# Altium project Skipper.PrjPcb (part 1 of 2)
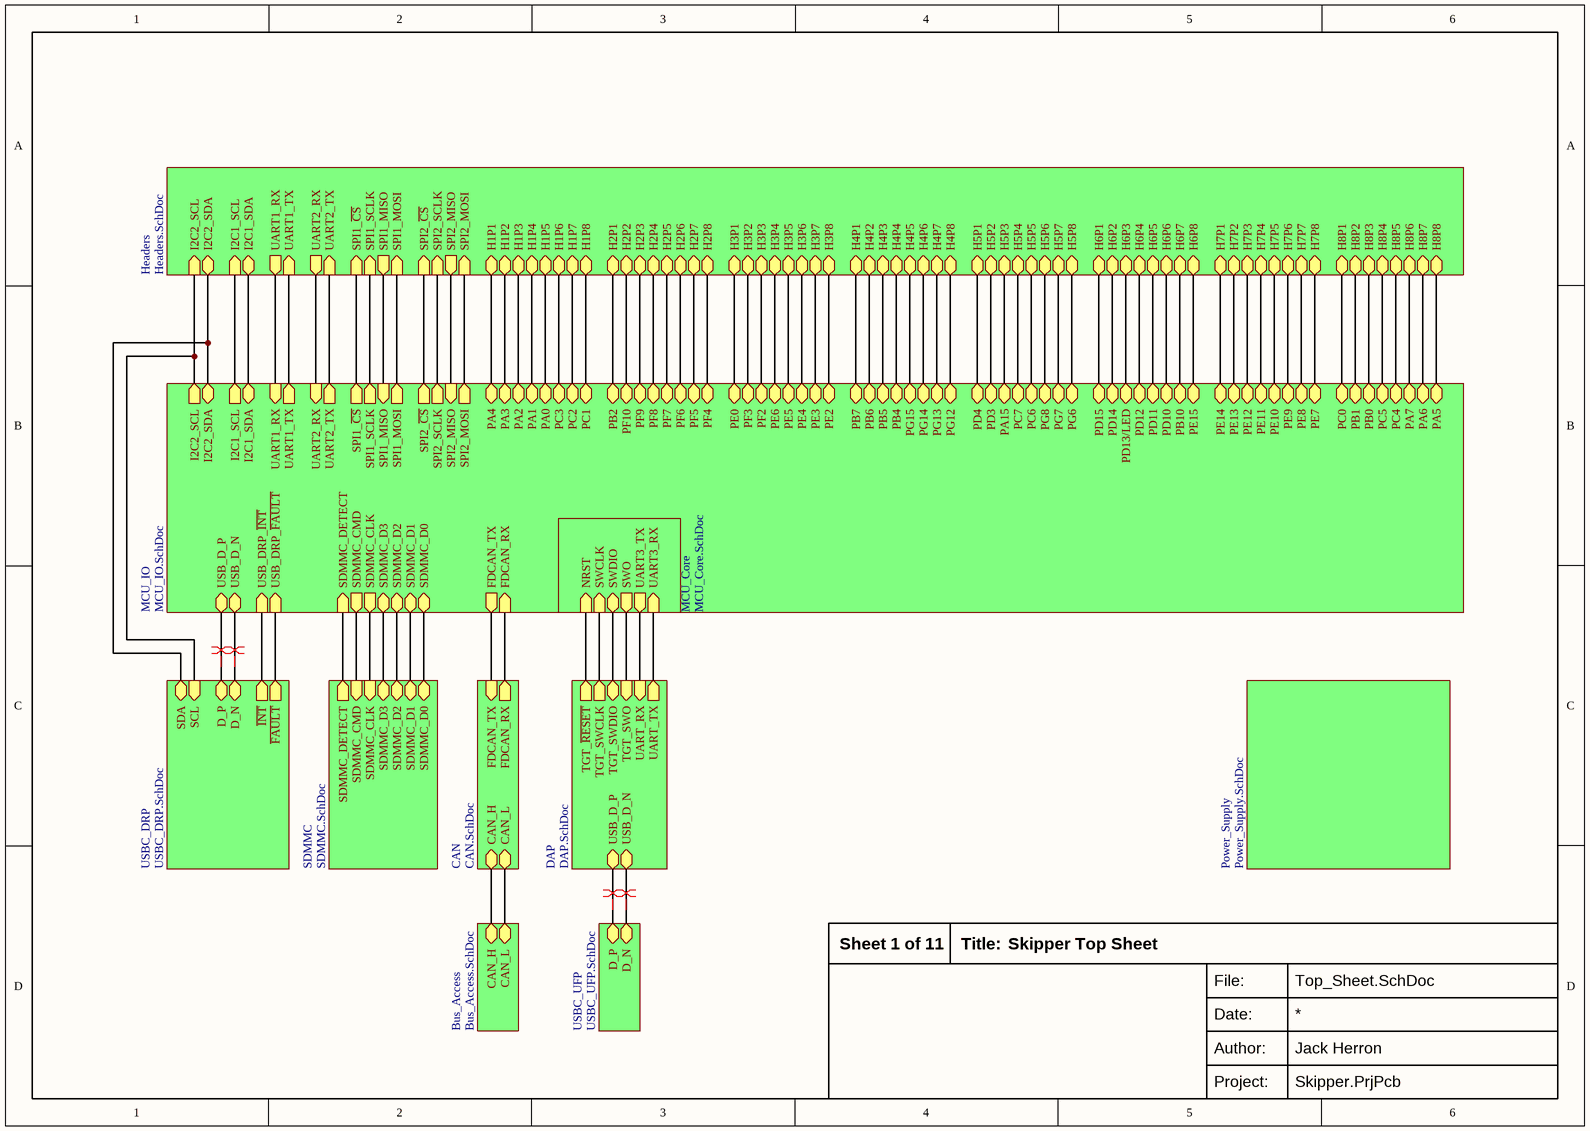
[diagram p0: Top_Sheet.SchDoc]
11 sheets, 219 parts. Net scope: hierarchical (ports join the sheet entries above them; power ports are global).
Board files: Skipper.PcbDoc, Panel.PcbDoc
Sheets:
  Top_Sheet.SchDoc
    MCU_IO = MCU_IO.SchDoc
    MCU_Core = MCU_Core.SchDoc
    SDMMC = SDMMC.SchDoc
    USBC_DRP = USBC_DRP.SchDoc
    USBC_UFP = USBC_UFP.SchDoc
    CAN = CAN.SchDoc
    DAP = DAP.SchDoc
    Power_Supply = Power_Supply.SchDoc
    Bus_Access = Bus_Access.SchDoc
    Headers = Headers.SchDoc

## Sheet Top_Sheet.SchDoc: Skipper Top Sheet
size 297 x 210 mm; Author: Jack Herron; SheetNumber: 1; SheetTotal: 11

### Sub-sheets
Bus_Access = Bus_Access.SchDoc: CAN_H (bidir), CAN_L (bidir)
CAN = CAN.SchDoc: CAN_H (bidir), FDCAN_TX (in), FDCAN_RX (out), CAN_L (bidir)
DAP = DAP.SchDoc: TGT_~{RESET} (out), TGT_SWCLK (out), USB_D_N (bidir), USB_D_P (bidir), TGT_SWDIO (bidir), TGT_SWO (in), UART_RX (in), UART_TX (out)
Headers = Headers.SchDoc: H1P1 (bidir), H1P2 (bidir), H1P3 (bidir), H1P4 (bidir), H1P5 (bidir), H1P6 (bidir), H1P7 (bidir), H1P8 (bidir), H2P1 (bidir), H2P2 (bidir), H2P3 (bidir), H2P4 (bidir), H2P5 (bidir), H2P6 (bidir), H2P7 (bidir), H2P8 (bidir), H3P1 (bidir), H3P2 (bidir), H3P3 (bidir), H3P4 (bidir), H3P5 (bidir), H3P6 (bidir), H3P7 (bidir), H3P8 (bidir), SPI1_MOSI (in), SPI1_SCLK (in), SPI1_~{CS} (in), SPI1_MISO (out), SPI2_MISO (out), SPI2_~{CS} (in), SPI2_SCLK (in), SPI2_MOSI (in), UART2_TX (in), UART1_TX (in), UART2_RX (out), UART1_RX (out), H4P1 (bidir), H4P2 (bidir), H4P3 (bidir), H4P4 (bidir), H4P5 (bidir), H4P6 (bidir), H4P7 (bidir), H4P8 (bidir), H5P1 (bidir), H5P2 (bidir), H5P3 (bidir), H5P4 (bidir), H5P5 (bidir), H5P6 (bidir), H5P8 (bidir), H5P7 (bidir), H6P1 (bidir), H6P2 (bidir), H6P3 (bidir), H6P4 (bidir), H6P5 (bidir), H6P6 (bidir), H6P7 (bidir), H6P8 (bidir), H7P1 (bidir), H7P2 (bidir), H7P3 (bidir), H7P4 (bidir), H7P5 (bidir), H7P6 (bidir), H7P7 (bidir), H7P8 (bidir), H8P2 (bidir), H8P1 (bidir), H8P3 (bidir), H8P4 (bidir), H8P5 (bidir), H8P6 (bidir), H8P7 (bidir), H8P8 (bidir), I2C2_SDA (bidir), I2C2_SCL (in), I2C1_SDA (bidir), I2C1_SCL (in)
MCU_Core = MCU_Core.SchDoc: SWDIO (bidir), NRST (in), SWCLK (in), SWO (out), UART3_TX (out), UART3_RX (in)
MCU_IO = MCU_IO.SchDoc: PA4 (bidir), PA3 (bidir), PA2 (bidir), PA1 (bidir), PA0 (bidir), PC3 (bidir), PC2 (bidir), PC1 (bidir), PD4 (bidir), PD3 (bidir), PA15 (bidir), PC7 (bidir), PC6 (bidir), PG8 (bidir), PG7 (bidir), PG6 (bidir), PB2 (bidir), PF10 (bidir), PF9 (bidir), PF8 (bidir), PF7 (bidir), PF6 (bidir), PF5 (bidir), PF4 (bidir), PE0 (bidir), PF3 (bidir), PF2 (bidir), PE6 (bidir), PE5 (bidir), PE4 (bidir), PE3 (bidir), PE2 (bidir), PB7 (bidir), PB6 (bidir), PB5 (bidir), PB4 (bidir), PG15 (bidir), PG14 (bidir), PG13 (bidir), PG12 (bidir), PD15 (bidir), PD14 (bidir), PD13/LED (bidir), PD12 (bidir), PD11 (bidir), PD10 (bidir), PB10 (bidir), PE15 (bidir), PE14 (bidir), PE13 (bidir), PE12 (bidir), PE11 (bidir), PE10 (bidir), PE9 (bidir), PE8 (bidir), PE7 (bidir), PC0 (bidir), PB1 (bidir), PB0 (bidir), PC5 (bidir), PC4 (bidir), PA7 (bidir), PA6 (bidir), PA5 (bidir), SPI2_MOSI (out), SPI2_MISO (in), SPI2_SCLK (out), SPI2_~{CS} (out), SPI1_MOSI (out), SPI1_MISO (in), SPI1_SCLK (out), SPI1_~{CS} (out), UART2_TX (out), UART2_RX (in), UART1_TX (out), UART1_RX (in), USB_D_P (bidir), USB_D_N (bidir), SDMMC_D0 (bidir), SDMMC_D1 (bidir), SDMMC_D2 (bidir), SDMMC_D3 (bidir), SDMMC_CLK (out), SDMMC_CMD (out), SDMMC_DETECT (in), FDCAN_RX (in), FDCAN_TX (out), USB_DRP_~{INT} (in), USB_DRP_~{FAULT} (in), I2C2_SDA (bidir), I2C2_SCL (out), I2C1_SDA (bidir), I2C1_SCL (out)
Power_Supply = Power_Supply.SchDoc: no entries
SDMMC = SDMMC.SchDoc: SDMMC_D0 (bidir), SDMMC_D1 (bidir), SDMMC_D2 (bidir), SDMMC_D3 (bidir), SDMMC_CLK (in), SDMMC_CMD (in), SDMMC_DETECT (out)
USBC_DRP = USBC_DRP.SchDoc: D_P (bidir), D_N (bidir), ~{INT} (out), ~{FAULT} (out), SCL (in), SDA (bidir)
USBC_UFP = USBC_UFP.SchDoc: D_P (bidir), D_N (bidir)

### Nets
CAN_H: sheet CAN/CAN_H, sheet Bus_Access/CAN_H
CAN_L: sheet CAN/CAN_L, sheet Bus_Access/CAN_L
DAP_D_N: sheet USBC_UFP/D_N, sheet DAP/USB_D_N
DAP_D_P: sheet USBC_UFP/D_P, sheet DAP/USB_D_P
DAP_RX: sheet MCU_Core/UART3_TX, sheet DAP/UART_RX
DAP_TX: sheet MCU_Core/UART3_RX, sheet DAP/UART_TX
FDCAN_RX: sheet MCU_IO/FDCAN_RX, sheet CAN/FDCAN_RX
FDCAN_TX: sheet MCU_IO/FDCAN_TX, sheet CAN/FDCAN_TX
I2C1_SCL: sheet MCU_IO/I2C1_SCL, sheet Headers/I2C1_SCL
I2C1_SDA: sheet MCU_IO/I2C1_SDA, sheet Headers/I2C1_SDA
I2C2_SCL: sheet MCU_IO/I2C2_SCL, sheet USBC_DRP/SCL, sheet Headers/I2C2_SCL
I2C2_SDA: sheet MCU_IO/I2C2_SDA, sheet USBC_DRP/SDA, sheet Headers/I2C2_SDA
NRST: sheet MCU_Core/NRST, sheet DAP/TGT_~{RESET}
PA0: sheet MCU_IO/PA0, sheet Headers/H1P5
PA1: sheet MCU_IO/PA1, sheet Headers/H1P4
PA2: sheet MCU_IO/PA2, sheet Headers/H1P3
PA3: sheet MCU_IO/PA3, sheet Headers/H1P2
PA4: sheet MCU_IO/PA4, sheet Headers/H1P1
PA5: sheet MCU_IO/PA5, sheet Headers/H8P8
PA6: sheet MCU_IO/PA6, sheet Headers/H8P7
PA7: sheet MCU_IO/PA7, sheet Headers/H8P6
PA15: sheet MCU_IO/PA15, sheet Headers/H5P3
PB0: sheet MCU_IO/PB0, sheet Headers/H8P3
PB1: sheet MCU_IO/PB1, sheet Headers/H8P2
PB2: sheet MCU_IO/PB2, sheet Headers/H2P1
PB4: sheet MCU_IO/PB4, sheet Headers/H4P4
PB5: sheet MCU_IO/PB5, sheet Headers/H4P3
PB6: sheet MCU_IO/PB6, sheet Headers/H4P2
PB7: sheet MCU_IO/PB7, sheet Headers/H4P1
PB10: sheet MCU_IO/PB10, sheet Headers/H6P7
PC0: sheet MCU_IO/PC0, sheet Headers/H8P1
PC1: sheet MCU_IO/PC1, sheet Headers/H1P8
PC2: sheet MCU_IO/PC2, sheet Headers/H1P7
PC3: sheet MCU_IO/PC3, sheet Headers/H1P6
PC4: sheet MCU_IO/PC4, sheet Headers/H8P5
PC5: sheet MCU_IO/PC5, sheet Headers/H8P4
PC6: sheet MCU_IO/PC6, sheet Headers/H5P5
PC7: sheet MCU_IO/PC7, sheet Headers/H5P4
PD3: sheet MCU_IO/PD3, sheet Headers/H5P2
PD4: sheet MCU_IO/PD4, sheet Headers/H5P1
PD10: sheet MCU_IO/PD10, sheet Headers/H6P6
PD11: sheet MCU_IO/PD11, sheet Headers/H6P5
PD12: sheet MCU_IO/PD12, sheet Headers/H6P4
PD13/LED: sheet MCU_IO/PD13/LED, sheet Headers/H6P3
PD14: sheet MCU_IO/PD14, sheet Headers/H6P2
PD15: sheet MCU_IO/PD15, sheet Headers/H6P1
PE0: sheet MCU_IO/PE0, sheet Headers/H3P1
PE2: sheet MCU_IO/PE2, sheet Headers/H3P8
PE3: sheet MCU_IO/PE3, sheet Headers/H3P7
PE4: sheet MCU_IO/PE4, sheet Headers/H3P6
PE5: sheet MCU_IO/PE5, sheet Headers/H3P5
PE6: sheet MCU_IO/PE6, sheet Headers/H3P4
PE7: sheet MCU_IO/PE7, sheet Headers/H7P8
PE8: sheet MCU_IO/PE8, sheet Headers/H7P7
PE9: sheet MCU_IO/PE9, sheet Headers/H7P6
PE10: sheet MCU_IO/PE10, sheet Headers/H7P5
PE11: sheet MCU_IO/PE11, sheet Headers/H7P4
PE12: sheet MCU_IO/PE12, sheet Headers/H7P3
PE13: sheet MCU_IO/PE13, sheet Headers/H7P2
PE14: sheet MCU_IO/PE14, sheet Headers/H7P1
PE15: sheet MCU_IO/PE15, sheet Headers/H6P8
PF2: sheet MCU_IO/PF2, sheet Headers/H3P3
PF3: sheet MCU_IO/PF3, sheet Headers/H3P2
PF4: sheet MCU_IO/PF4, sheet Headers/H2P8
PF5: sheet MCU_IO/PF5, sheet Headers/H2P7
PF6: sheet MCU_IO/PF6, sheet Headers/H2P6
PF7: sheet MCU_IO/PF7, sheet Headers/H2P5
PF8: sheet MCU_IO/PF8, sheet Headers/H2P4
PF9: sheet MCU_IO/PF9, sheet Headers/H2P3
PF10: sheet MCU_IO/PF10, sheet Headers/H2P2
PG6: sheet MCU_IO/PG6, sheet Headers/H5P8
PG7: sheet MCU_IO/PG7, sheet Headers/H5P7
PG8: sheet MCU_IO/PG8, sheet Headers/H5P6
PG12: sheet MCU_IO/PG12, sheet Headers/H4P8
PG13: sheet MCU_IO/PG13, sheet Headers/H4P7
PG14: sheet MCU_IO/PG14, sheet Headers/H4P6
PG15: sheet MCU_IO/PG15, sheet Headers/H4P5
SDMMC_CLK: sheet MCU_IO/SDMMC_CLK, sheet SDMMC/SDMMC_CLK
SDMMC_CMD: sheet MCU_IO/SDMMC_CMD, sheet SDMMC/SDMMC_CMD
SDMMC_D0: sheet MCU_IO/SDMMC_D0, sheet SDMMC/SDMMC_D0
SDMMC_D1: sheet MCU_IO/SDMMC_D1, sheet SDMMC/SDMMC_D1
SDMMC_D2: sheet MCU_IO/SDMMC_D2, sheet SDMMC/SDMMC_D2
SDMMC_D3: sheet MCU_IO/SDMMC_D3, sheet SDMMC/SDMMC_D3
SDMMC_DETECT: sheet MCU_IO/SDMMC_DETECT, sheet SDMMC/SDMMC_DETECT
SPI1_~{CS}: sheet MCU_IO/SPI1_~{CS}, sheet Headers/SPI1_~{CS}
SPI1_MISO: sheet MCU_IO/SPI1_MISO, sheet Headers/SPI1_MISO
SPI1_MOSI: sheet MCU_IO/SPI1_MOSI, sheet Headers/SPI1_MOSI
SPI1_SCLK: sheet MCU_IO/SPI1_SCLK, sheet Headers/SPI1_SCLK
SPI2_~{CS}: sheet MCU_IO/SPI2_~{CS}, sheet Headers/SPI2_~{CS}
SPI2_MISO: sheet MCU_IO/SPI2_MISO, sheet Headers/SPI2_MISO
SPI2_MOSI: sheet MCU_IO/SPI2_MOSI, sheet Headers/SPI2_MOSI
SPI2_SCLK: sheet MCU_IO/SPI2_SCLK, sheet Headers/SPI2_SCLK
SWCLK: sheet MCU_Core/SWCLK, sheet DAP/TGT_SWCLK
SWDIO: sheet MCU_Core/SWDIO, sheet DAP/TGT_SWDIO
SWO: sheet MCU_Core/SWO, sheet DAP/TGT_SWO
UART1_RX: sheet MCU_IO/UART1_RX, sheet Headers/UART1_RX
UART1_TX: sheet MCU_IO/UART1_TX, sheet Headers/UART1_TX
UART2_RX: sheet MCU_IO/UART2_RX, sheet Headers/UART2_RX
UART2_TX: sheet MCU_IO/UART2_TX, sheet Headers/UART2_TX
USB_D_N: sheet MCU_IO/USB_D_N, sheet USBC_DRP/D_N
USB_D_P: sheet MCU_IO/USB_D_P, sheet USBC_DRP/D_P
USB_DRP_~{FAULT}: sheet MCU_IO/USB_DRP_~{FAULT}, sheet USBC_DRP/~{FAULT}
USB_DRP_~{INT}: sheet MCU_IO/USB_DRP_~{INT}, sheet USBC_DRP/~{INT}

### Layout directives
differential pair: DAP_D_N, DAP_D_P, USB_D_N, USB_D_P

### Notes on the sheet
- Title:
- File:
- Date:
- Project:
- Author:

## Sheet MCU_IO.SchDoc: Skipper MCU IO
size 297 x 210 mm; Author: Jack Herron; SheetNumber: 2; SheetTotal: 11
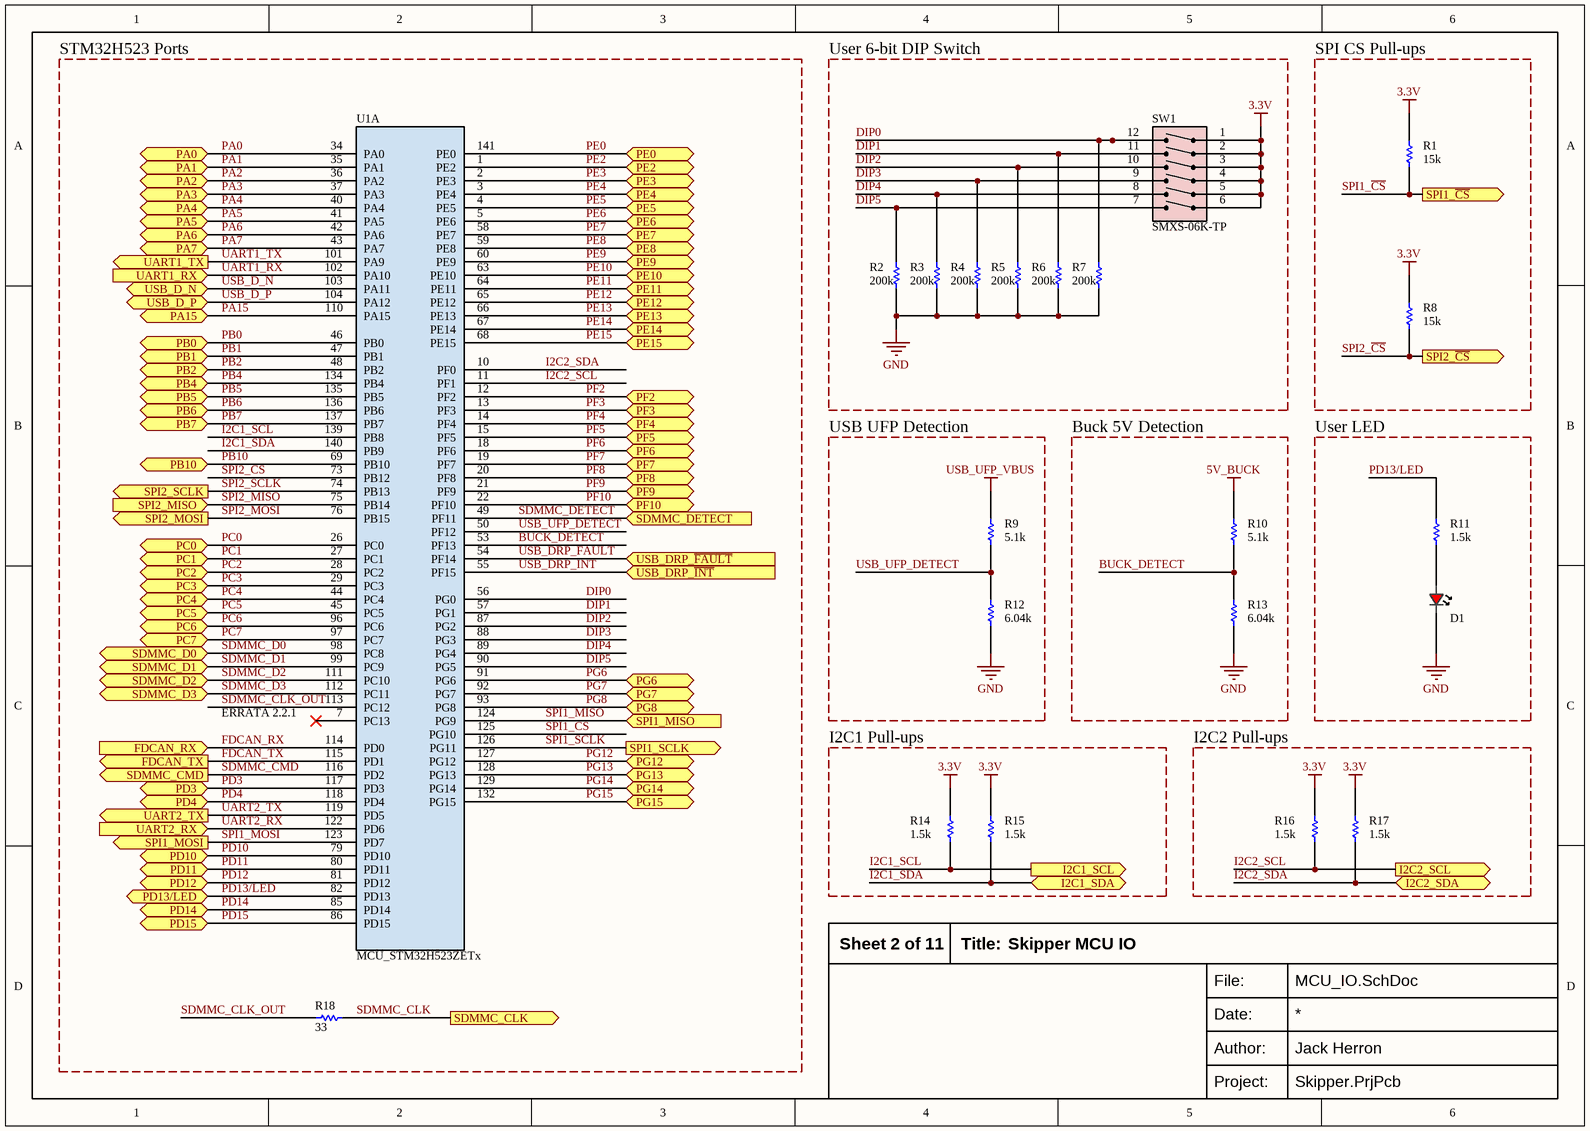
[diagram p1: MCU_IO.SchDoc]

### Parts
D1  KT-0603R  [LED-0603]  (value not drawn)
R1  value 15k  [RESISTOR-0402]  (hidden comment: 0402WGF1502TCE)
R2  value 200k  [RESISTOR-0402]  (hidden comment: 0402WGF2003TCE)
R3  value 200k  [RESISTOR-0402]  (hidden comment: 0402WGF2003TCE)
R4  value 200k  [RESISTOR-0402]  (hidden comment: 0402WGF2003TCE)
R5  value 200k  [RESISTOR-0402]  (hidden comment: 0402WGF2003TCE)
R6  value 200k  [RESISTOR-0402]  (hidden comment: 0402WGF2003TCE)
R7  value 200k  [RESISTOR-0402]  (hidden comment: 0402WGF2003TCE)
R8  value 15k  [RESISTOR-0402]  (hidden comment: 0402WGF1502TCE)
R9  value 5.1k  [RESISTOR-0402]  (hidden comment: 0402WGF5101TCE)
R10  value 5.1k  [RESISTOR-0402]  (hidden comment: 0402WGF5101TCE)
R11  value 1.5k  [RESISTOR-0402]  (hidden comment: 0402WGF1501TCE)
R12  value 6.04k  [RESISTOR-0402]  (hidden comment: RC0402FR-076K04L)
R13  value 6.04k  [RESISTOR-0402]  (hidden comment: RC0402FR-076K04L)
R14  value 1.5k  [RESISTOR-0402]  (hidden comment: 0402WGF1501TCE)
R15  value 1.5k  [RESISTOR-0402]  (hidden comment: 0402WGF1501TCE)
R16  value 1.5k  [RESISTOR-0402]  (hidden comment: 0402WGF1501TCE)
R17  value 1.5k  [RESISTOR-0402]  (hidden comment: 0402WGF1501TCE)
R18  value 33  [RESISTOR-0402]  (hidden comment: 0402WGF330JTCE)
SW1  SMXS-06K-TP  [SWITCH_SMXS-06K-TP]
U1  MCU_STM32H523ZETx  [LQFP-144-22x22]  (part A of 3)

### Blocks framed on the sheet
STM32H523 Ports: R18 U1
User 6-bit DIP Switch: R2-R7 SW1
SPI CS Pull-ups: R1 R8
USB UFP Detection: R9 R12
Buck 5V Detection: R10 R13
User LED: D1 R11
I2C1 Pull-ups: R14 R15
I2C2 Pull-ups: R16 R17

### Ports
FDCAN_RX (in, see Top_Sheet[2C], CAN[2B]), FDCAN_TX (out, see Top_Sheet[2C], CAN[2B]), I2C1_SCL (out, see Top_Sheet[1B], Headers[1D]), I2C1_SDA (bidir, see Top_Sheet[1B], Headers[1D]), I2C2_SCL (out, see Top_Sheet[1B], Headers[3D]), I2C2_SDA (bidir, see Top_Sheet[1B], Headers[3D]), PA0 (bidir, see Top_Sheet[3B]), PA1 (bidir, see Top_Sheet[3B]), PA2 (bidir, see Top_Sheet[2B]), PA3 (bidir, see Top_Sheet[2B]), PA4 (bidir, see Top_Sheet[2B]), PA5 (bidir, see Top_Sheet[6B]), PA6 (bidir, see Top_Sheet[6B]), PA7 (bidir, see Top_Sheet[6B]), PA15 (bidir, see Top_Sheet[4B]), PB0 (bidir, see Top_Sheet[6B]), PB1 (bidir, see Top_Sheet[6B]), PB2 (bidir, see Top_Sheet[3B]), PB4 (bidir, see Top_Sheet[4B]), PB5 (bidir, see Top_Sheet[4B]), PB6 (bidir, see Top_Sheet[4B]), PB7 (bidir, see Top_Sheet[4B]), PB10 (bidir, see Top_Sheet[5B]), PC0 (bidir, see Top_Sheet[6B]), PC1 (bidir, see Top_Sheet[3B]), PC2 (bidir, see Top_Sheet[3B]), PC3 (bidir, see Top_Sheet[3B]), PC4 (bidir, see Top_Sheet[6B]), PC5 (bidir, see Top_Sheet[6B]), PC6 (bidir, see Top_Sheet[4B]), PC7 (bidir, see Top_Sheet[4B]), PD3 (bidir, see Top_Sheet[4B]), PD4 (bidir, see Top_Sheet[4B]), PD10 (bidir, see Top_Sheet[5B]), PD11 (bidir, see Top_Sheet[5B]), PD12 (bidir, see Top_Sheet[5B]), PD13/LED (bidir, see Top_Sheet[5B]), PD14 (bidir, see Top_Sheet[5B]), PD15 (bidir, see Top_Sheet[5B]), PE0 (bidir, see Top_Sheet[3B]), PE2 (bidir, see Top_Sheet[4B]), PE3 (bidir, see Top_Sheet[4B]), PE4 (bidir, see Top_Sheet[4B]), PE5 (bidir, see Top_Sheet[3B]), PE6 (bidir, see Top_Sheet[3B]), PE7 (bidir, see Top_Sheet[5B]), PE8 (bidir, see Top_Sheet[5B]), PE9 (bidir, see Top_Sheet[5B]), PE10 (bidir, see Top_Sheet[5B]), PE11 (bidir, see Top_Sheet[5B]), PE12 (bidir, see Top_Sheet[5B]), PE13 (bidir, see Top_Sheet[5B]), PE14 (bidir, see Top_Sheet[5B]), PE15 (bidir, see Top_Sheet[5B]), PF2 (bidir, see Top_Sheet[3B]), PF3 (bidir, see Top_Sheet[3B]), PF4 (bidir, see Top_Sheet[3B]), PF5 (bidir, see Top_Sheet[3B]), PF6 (bidir, see Top_Sheet[3B]), PF7 (bidir, see Top_Sheet[3B]), PF8 (bidir, see Top_Sheet[3B]), PF9 (bidir, see Top_Sheet[3B]), PF10 (bidir, see Top_Sheet[3B]), PG6 (bidir, see Top_Sheet[5B]), PG7 (bidir, see Top_Sheet[5B]), PG8 (bidir, see Top_Sheet[4B]), PG12 (bidir, see Top_Sheet[4B]), PG13 (bidir, see Top_Sheet[4B]), PG14 (bidir, see Top_Sheet[4B]), PG15 (bidir, see Top_Sheet[4B]), SDMMC_CLK (out, see Top_Sheet[2C], SDMMC[2C]), SDMMC_CMD (out, see Top_Sheet[2C], SDMMC[2C]), SDMMC_D0 (bidir, see Top_Sheet[2C], SDMMC[2B]), SDMMC_D1 (bidir, see Top_Sheet[2C], SDMMC[2B]), SDMMC_D2 (bidir, see Top_Sheet[2C], SDMMC[2C]), SDMMC_D3 (bidir, see Top_Sheet[2C], SDMMC[2C]), SDMMC_DETECT (in, see Top_Sheet[2C], SDMMC[2C]), SPI1_MISO (in, see Top_Sheet[2B], Headers[1D]), SPI1_MOSI (out, see Top_Sheet[2B], Headers[1D]), SPI1_SCLK (out, see Top_Sheet[2B], Headers[1C]), SPI1_~{CS} (out, see Top_Sheet[2B], Headers[1C]), SPI2_MISO (in, see Top_Sheet[2B], Headers[3D]), SPI2_MOSI (out, see Top_Sheet[2B], Headers[3D]), SPI2_SCLK (out, see Top_Sheet[2B], Headers[3C]), SPI2_~{CS} (out, see Top_Sheet[2B], Headers[3C]), UART1_RX (in, see Top_Sheet[2B], Headers[1D]), UART1_TX (out, see Top_Sheet[2B], Headers[1D]), UART2_RX (in, see Top_Sheet[2B], Headers[3D]), UART2_TX (out, see Top_Sheet[2B], Headers[3D]), USB_D_N (bidir, see Top_Sheet[1C]), USB_D_P (bidir, see Top_Sheet[1C]), USB_DRP_~{FAULT} (in, see Top_Sheet[2C]), USB_DRP_~{INT} (in, see Top_Sheet[1C])

### Nets
3.3V: R1.2 R8.2 R14.2 R15.2 R16.2 R17.2 SW1.1 SW1.2 SW1.3 SW1.4 SW1.5 SW1.6
5V_BUCK: R10.2
GND: D1.K R2.1 R3.1 R4.1 R5.1 R6.1 R7.1 R12.1 R13.1
USB_UFP_VBUS: R9.2
BUCK_DETECT: R10.1 R13.2 U1.53(PF13)  [project net BUCK_DETECT_2]
DIP0: R7.2 SW1.12 U1.56(PG0)  [project net DIP0_2]
DIP1: R6.2 SW1.11 U1.57(PG1)  [project net DIP1_2]
DIP2: R5.2 SW1.10 U1.87(PG2)  [project net DIP2_2]
DIP3: R4.2 SW1.9 U1.88(PG3)  [project net DIP3_2]
DIP4: R3.2 SW1.8 U1.89(PG4)  [project net DIP4_2]
DIP5: R2.2 SW1.7 U1.90(PG5)  [project net DIP5_2]
FDCAN_RX: U1.114(PD0) ; port FDCAN_RX
FDCAN_TX: U1.115(PD1) ; port FDCAN_TX
I2C1_SCL: R14.1 U1.139(PB8) ; port I2C1_SCL
I2C1_SDA: R15.1 U1.140(PB9) ; port I2C1_SDA
I2C2_SCL: R16.1 U1.11(PF1) ; port I2C2_SCL
I2C2_SDA: R17.1 U1.10(PF0) ; port I2C2_SDA
PA0: U1.34(PA0) ; port PA0
PA1: U1.35(PA1) ; port PA1
PA2: U1.36(PA2) ; port PA2
PA3: U1.37(PA3) ; port PA3
PA4: U1.40(PA4) ; port PA4
PA5: U1.41(PA5) ; port PA5
PA6: U1.42(PA6) ; port PA6
PA7: U1.43(PA7) ; port PA7
PA15: U1.110(PA15) ; port PA15
PB0: U1.46(PB0) ; port PB0
PB1: U1.47(PB1) ; port PB1
PB2: U1.48(PB2) ; port PB2
PB4: U1.134(PB4) ; port PB4
PB5: U1.135(PB5) ; port PB5
PB6: U1.136(PB6) ; port PB6
PB7: U1.137(PB7) ; port PB7
PB10: U1.69(PB10) ; port PB10
PC0: U1.26(PC0) ; port PC0
PC1: U1.27(PC1) ; port PC1
PC2: U1.28(PC2) ; port PC2
PC3: U1.29(PC3) ; port PC3
PC4: U1.44(PC4) ; port PC4
PC5: U1.45(PC5) ; port PC5
PC6: U1.96(PC6) ; port PC6
PC7: U1.97(PC7) ; port PC7
PD3: U1.117(PD3) ; port PD3
PD4: U1.118(PD4) ; port PD4
PD10: U1.79(PD10) ; port PD10
PD11: U1.80(PD11) ; port PD11
PD12: U1.81(PD12) ; port PD12
PD13/LED: R11.2 U1.82(PD13) ; port PD13/LED
PD14: U1.85(PD14) ; port PD14
PD15: U1.86(PD15) ; port PD15
PE0: U1.141(PE0) ; port PE0
PE2: U1.1(PE2) ; port PE2
PE3: U1.2(PE3) ; port PE3
PE4: U1.3(PE4) ; port PE4
PE5: U1.4(PE5) ; port PE5
PE6: U1.5(PE6) ; port PE6
PE7: U1.58(PE7) ; port PE7
PE8: U1.59(PE8) ; port PE8
PE9: U1.60(PE9) ; port PE9
PE10: U1.63(PE10) ; port PE10
PE11: U1.64(PE11) ; port PE11
PE12: U1.65(PE12) ; port PE12
PE13: U1.66(PE13) ; port PE13
PE14: U1.67(PE14) ; port PE14
PE15: U1.68(PE15) ; port PE15
PF2: U1.12(PF2) ; port PF2
PF3: U1.13(PF3) ; port PF3
PF4: U1.14(PF4) ; port PF4
PF5: U1.15(PF5) ; port PF5
PF6: U1.18(PF6) ; port PF6
PF7: U1.19(PF7) ; port PF7
PF8: U1.20(PF8) ; port PF8
PF9: U1.21(PF9) ; port PF9
PF10: U1.22(PF10) ; port PF10
PG6: U1.91(PG6) ; port PG6
PG7: U1.92(PG7) ; port PG7
PG8: U1.93(PG8) ; port PG8
PG12: U1.127(PG12) ; port PG12
PG13: U1.128(PG13) ; port PG13
PG14: U1.129(PG14) ; port PG14
PG15: U1.132(PG15) ; port PG15
SDMMC_CLK: R18.1 ; port SDMMC_CLK
SDMMC_CLK_OUT: R18.2 U1.113(PC12)  [project net SDMMC_CLK_OUT_2]
SDMMC_CMD: U1.116(PD2) ; port SDMMC_CMD
SDMMC_D0: U1.98(PC8) ; port SDMMC_D0
SDMMC_D1: U1.99(PC9) ; port SDMMC_D1
SDMMC_D2: U1.111(PC10) ; port SDMMC_D2
SDMMC_D3: U1.112(PC11) ; port SDMMC_D3
SDMMC_DETECT: U1.49(PF11) ; port SDMMC_DETECT
SPI1_~{CS}: R1.1 U1.125(PG10) ; port SPI1_~{CS}
SPI1_MISO: U1.124(PG9) ; port SPI1_MISO
SPI1_MOSI: U1.123(PD7) ; port SPI1_MOSI
SPI1_SCLK: U1.126(PG11) ; port SPI1_SCLK
SPI2_~{CS}: R8.1 U1.73(PB12) ; port SPI2_~{CS}
SPI2_MISO: U1.75(PB14) ; port SPI2_MISO
SPI2_MOSI: U1.76(PB15) ; port SPI2_MOSI
SPI2_SCLK: U1.74(PB13) ; port SPI2_SCLK
UART1_RX: U1.102(PA10) ; port UART1_RX
UART1_TX: U1.101(PA9) ; port UART1_TX
UART2_RX: U1.122(PD6) ; port UART2_RX
UART2_TX: U1.119(PD5) ; port UART2_TX
USB_D_N: U1.103(PA11) ; port USB_D_N
USB_D_P: U1.104(PA12) ; port USB_D_P
USB_DRP_~{FAULT}: U1.54(PF14) ; port USB_DRP_~{FAULT}
USB_DRP_~{INT}: U1.55(PF15) ; port USB_DRP_~{INT}
USB_UFP_DETECT: R9.1 R12.2 U1.50(PF12)  [project net USB_UFP_DETECT_2]
NetD1_A: D1.A R11.1

Not connected (* = marked no-connect by the designer): U1 7(PC13)*

### Notes on the sheet
- ERRATA 2.2.1
- Title:
- File:
- Date:
- Project:
- Author:

### Library data of the parts
D1 = LED_KT-0603R: LED - Red - 0603; Manufacturer 1: Hubei KENTO Elec; Manufacturer Part Number 1: KT-0603R; Supplier 1: LCSC; Supplier Part Number 1: C2286
R1 R8 = RESISTOR_0402WGF1502TCE: Resistor - 15k - 0402; Manufacturer 1: UNI-ROYAL; Voltage: 50V; Wattage: 62.5mW; Manufacturer Part Number 1: 0402WGF1502TCE; Supplier 1: LCSC; Supplier Part Number 1: C25756
R2-R7 = RESISTOR_0402WGF2003TCE: Resistor - 200k - 0402; Manufacturer 1: UNI-ROYAL; Wattage: 62.5mW; Voltage: 50V; Manufacturer Part Number 1: 0402WGF2003TCE; Supplier 1: LCSC; Supplier Part Number 1: C25764
R9 R10 = RESISTOR_0402WGF5101TCE: Resistor - 5.1k - 0402; Manufacturer 1: UNI-ROYAL; Voltage: 50V; Wattage: 62.5mW; Manufacturer Part Number 1: 0402WGF5101TCE; Supplier 1: LCSC; Supplier Part Number 1: C25905
R11 R14-R17 = RESISTOR_0402WGF1501TCE: Resistor - 1.5k - 0402; Manufacturer 1: UNI-ROYAL; Voltage: 50V; Wattage: 62.5mW; Manufacturer Part Number 1: 0402WGF1501TCE; Supplier 1: LCSC; Supplier Part Number 1: C25867
R12 R13 = RESISTOR_RC0402FR-076K04L: Resistor - 6.04k - 0402; Manufacturer 1: Yageo; Voltage: 50V; Wattage: 62.5mW; Manufacturer Part Number 1: RC0402FR-076K04L; Supplier 1: LCSC; Supplier Part Number 1: C97819
R18 = RESISTOR_0402WGF330JTCE: Resistor - 33 -0402; Manufacturer 1: UNI-ROYAL(Uniroyal Elec); Voltage: 50V; Wattage: 62.5mW; Manufacturer Part Number 1: 0402WGF330JTCE; Supplier 1: LCSC; Supplier Part Number 1: C25105
SW1 = SWITCH_SMXS-06K-TP: 6 bit DIP switch; Manufacturer 1: SM Switch; Manufacturer Part Number 1: SMXS-06K-TP; Supplier 1: LCSC; Supplier Part Number 1: C5439765
U1 = MCU_STM32H523ZETx: Arm Cortex-M33 MCU - 512KB Flash - 272KB SRAM - 250 MHz - LQFP144; Manufacturer 1: ST; Manufacturer Part Number 1: STM32H523ZET6; Supplier 1: Mouser; Supplier Part Number 1: 511-STM32H523ZET6

## Sheet MCU_Core.SchDoc: Skipper MCU Core
size 297 x 210 mm; Author: Jack Herron; SheetNumber: 3; SheetTotal: 11
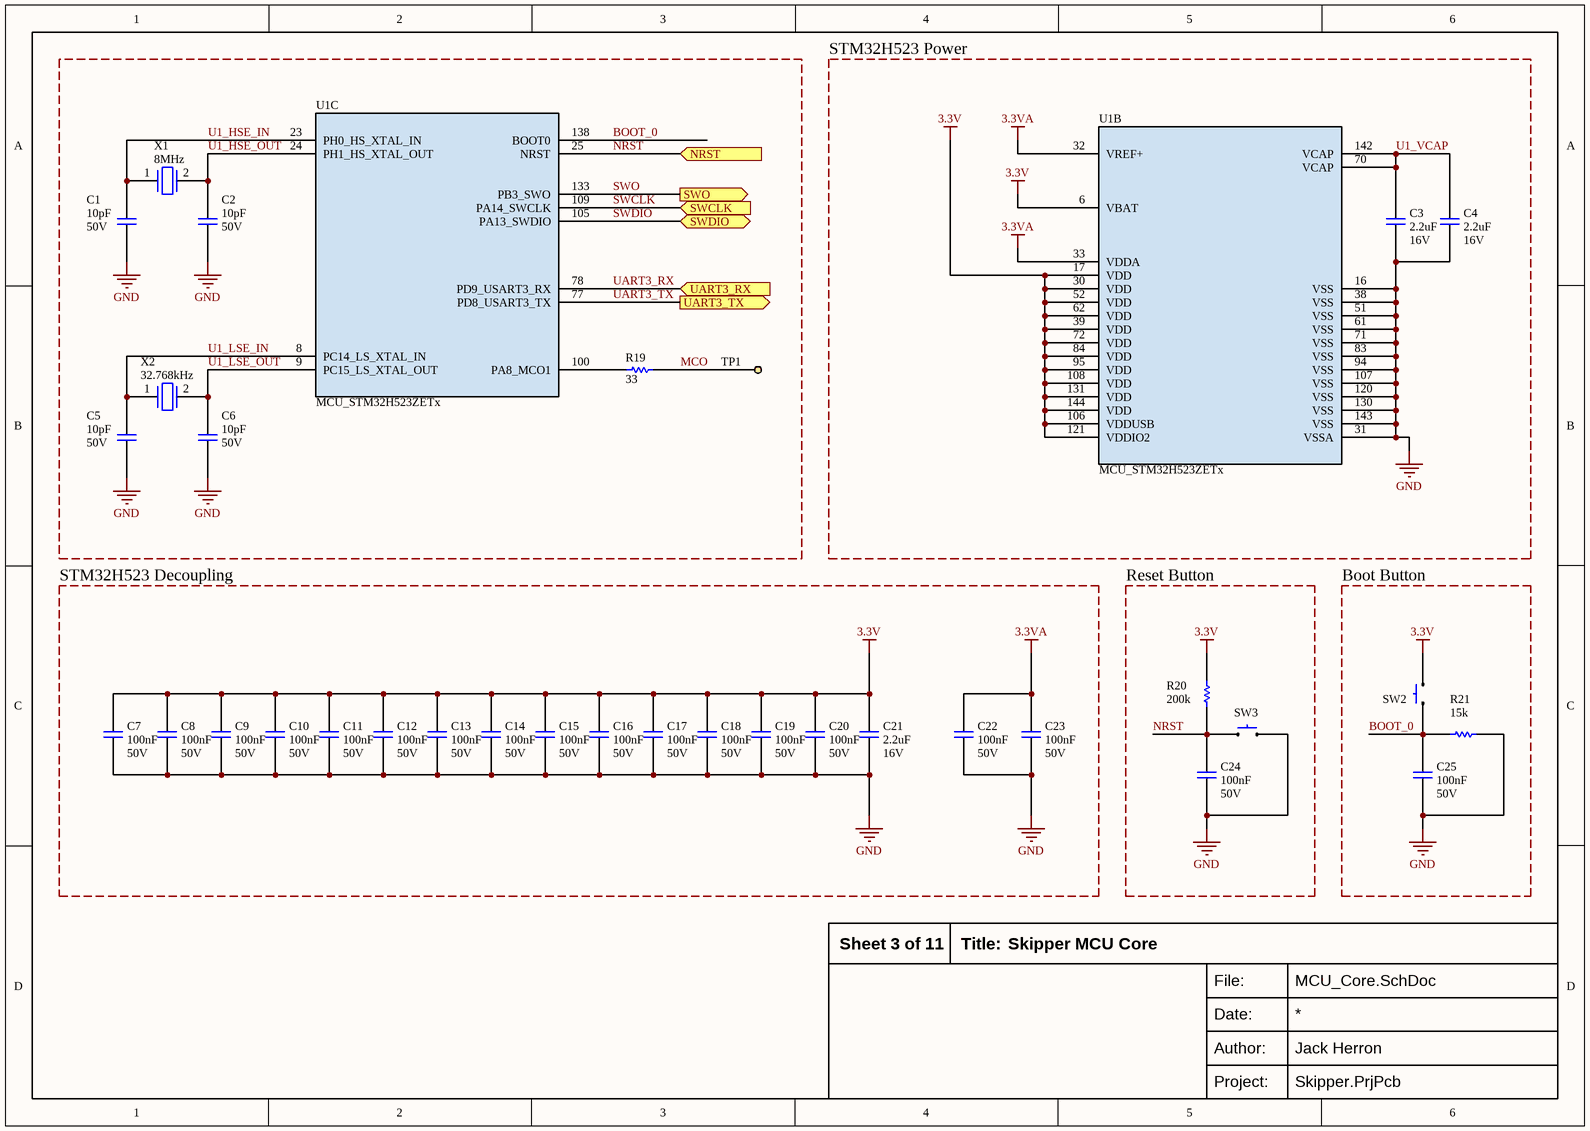
[diagram p2: MCU_Core.SchDoc]

### Parts
C1  value 10pF  Voltage: 50V  [CAPACITOR-0402]  (hidden comment: CL05C100JB5NNNC)
C2  value 10pF  Voltage: 50V  [CAPACITOR-0402]  (hidden comment: CL05C100JB5NNNC)
C3  value 2.2uF  Voltage: 16V  [CAPACITOR-0603]  (hidden comment: CL10A225KO8NNNC)
C4  value 2.2uF  Voltage: 16V  [CAPACITOR-0603]  (hidden comment: CL10A225KO8NNNC)
C5  value 10pF  Voltage: 50V  [CAPACITOR-0402]  (hidden comment: CL05C100JB5NNNC)
C6  value 10pF  Voltage: 50V  [CAPACITOR-0402]  (hidden comment: CL05C100JB5NNNC)
C7  value 100nF  Voltage: 50V  [CAPACITOR-0402]  (hidden comment: CL05B104KB54PNC)
C8  value 100nF  Voltage: 50V  [CAPACITOR-0402]  (hidden comment: CL05B104KB54PNC)
C9  value 100nF  Voltage: 50V  [CAPACITOR-0402]  (hidden comment: CL05B104KB54PNC)
C10  value 100nF  Voltage: 50V  [CAPACITOR-0402]  (hidden comment: CL05B104KB54PNC)
C11  value 100nF  Voltage: 50V  [CAPACITOR-0402]  (hidden comment: CL05B104KB54PNC)
C12  value 100nF  Voltage: 50V  [CAPACITOR-0402]  (hidden comment: CL05B104KB54PNC)
C13  value 100nF  Voltage: 50V  [CAPACITOR-0402]  (hidden comment: CL05B104KB54PNC)
C14  value 100nF  Voltage: 50V  [CAPACITOR-0402]  (hidden comment: CL05B104KB54PNC)
C15  value 100nF  Voltage: 50V  [CAPACITOR-0402]  (hidden comment: CL05B104KB54PNC)
C16  value 100nF  Voltage: 50V  [CAPACITOR-0402]  (hidden comment: CL05B104KB54PNC)
C17  value 100nF  Voltage: 50V  [CAPACITOR-0402]  (hidden comment: CL05B104KB54PNC)
C18  value 100nF  Voltage: 50V  [CAPACITOR-0402]  (hidden comment: CL05B104KB54PNC)
C19  value 100nF  Voltage: 50V  [CAPACITOR-0402]  (hidden comment: CL05B104KB54PNC)
C20  value 100nF  Voltage: 50V  [CAPACITOR-0402]  (hidden comment: CL05B104KB54PNC)
C21  value 2.2uF  Voltage: 16V  [CAPACITOR-0603]  (hidden comment: CL10A225KO8NNNC)
C22  value 100nF  Voltage: 50V  [CAPACITOR-0402]  (hidden comment: CL05B104KB54PNC)
C23  value 100nF  Voltage: 50V  [CAPACITOR-0402]  (hidden comment: CL05B104KB54PNC)
C24  value 100nF  Voltage: 50V  [CAPACITOR-0402]  (hidden comment: CL05B104KB54PNC)
C25  value 100nF  Voltage: 50V  [CAPACITOR-0402]  (hidden comment: CL05B104KB54PNC)
R19  value 33  [RESISTOR-0402]  (hidden comment: 0402WGF330JTCE)
R20  value 200k  [RESISTOR-0402]  (hidden comment: 0402WGF2003TCE)
R21  value 15k  [RESISTOR-0402]  (hidden comment: 0402WGF1502TCE)
SW2  TS-1088-AR02016  [TACTILE-SWITCH_TS-1088-AR02016]  (value not drawn)
SW3  TS-1088-AR02016  [TACTILE-SWITCH_TS-1088-AR02016]  (value not drawn)
TP1  Test Point 1mm  [TESTPOINT_1mm]  (value not drawn)  (no BOM)
U1  MCU_STM32H523ZETx  [LQFP-144-22x22]  (parts B,C of 3)
X1  value 8MHz  [CRYSTAL_3225-2P]  (hidden comment: NX3225GD-8MHZ-STD-CRA-3)
X2  value 32.768kHz  [CRYSTAL_3215-2P]  (hidden comment: FC-135 32.7680KA-AG3)

### Blocks framed on the sheet
STM32H523 Power: C3 C4 U1
STM32H523 Decoupling: C7-C23
Reset Button: C24 R20 SW3
Boot Button: C25 R21 SW2

### Ports
NRST (in, see Top_Sheet[3C]), SWCLK (in, see Top_Sheet[3C]), SWDIO (bidir, see Top_Sheet[3C]), SWO (out, see Top_Sheet[3C]), UART3_RX (in, see Top_Sheet[3C]), UART3_TX (out, see Top_Sheet[3C])

### Nets
3.3V: C7.2 C8.2 C9.2 C10.2 C11.2 C12.2 C13.2 C14.2 C15.2 C16.2 C17.2 C18.2 C19.2 C20.2 C21.2 R20.2 SW2.2 U1.6(VBAT) U1.17(VDD) U1.30(VDD) U1.39(VDD) U1.52(VDD) U1.62(VDD) U1.72(VDD) U1.84(VDD) U1.95(VDD) U1.106(VDDUSB) U1.108(VDD) U1.121(VDDIO2) U1.131(VDD) U1.144(VDD)
3.3VA: C22.2 C23.2 U1.32(VREF+) U1.33(VDDA)
GND: C1.1 C2.1 C3.1 C4.1 C5.1 C6.1 C7.1 C8.1 C9.1 C10.1 C11.1 C12.1 C13.1 C14.1 C15.1 C16.1 C17.1 C18.1 C19.1 C20.1 C21.1 C22.1 C23.1 C24.1 C25.1 R21.1 SW3.2 U1.16(VSS) U1.31(VSSA) U1.38(VSS) U1.51(VSS) U1.61(VSS) U1.71(VSS) U1.83(VSS) U1.94(VSS) U1.107(VSS) U1.120(VSS) U1.130(VSS) U1.143(VSS)
BOOT_0: C25.2 R21.2 SW2.1 U1.138(BOOT0)  [project net BOOT_0_3]
MCO: R19.1 TP1.1  [project net MCO_3]
NRST: C24.2 R20.1 SW3.1 U1.25(NRST) ; port NRST
SWCLK: U1.109(PA14_SWCLK) ; port SWCLK
SWDIO: U1.105(PA13_SWDIO) ; port SWDIO
SWO: U1.133(PB3_SWO) ; port SWO
U1_HSE_IN: C1.2 U1.23(PH0_HS_XTAL_IN) X1.1  [project net U1_HSE_IN_3]
U1_HSE_OUT: C2.2 U1.24(PH1_HS_XTAL_OUT) X1.2  [project net U1_HSE_OUT_3]
U1_LSE_IN: C5.2 U1.8(PC14_LS_XTAL_IN) X2.1  [project net U1_LSE_IN_3]
U1_LSE_OUT: C6.2 U1.9(PC15_LS_XTAL_OUT) X2.2  [project net U1_LSE_OUT_3]
U1_VCAP: C3.2 C4.2 U1.70(VCAP) U1.142(VCAP)  [project net U1_VCAP_3]
UART3_RX: U1.78(PD9_USART3_RX) ; port UART3_RX  [project net DAP_TX]
UART3_TX: U1.77(PD8_USART3_TX) ; port UART3_TX  [project net DAP_RX]
NetR19_2: R19.2 U1.100(PA8_MCO1)

### Notes on the sheet
- Title:
- File:
- Date:
- Project:
- Author:

### Library data of the parts
C1 C2 C5 C6 = CAPACITOR_CL05C100JB5NNNC: Capacitor - 10pF - 50V - 0402 - C0G; Manufacturer 1: Samsung; Manufacturer Part Number 1: CL05C100JB5NNNC; Supplier 1: LCSC; Supplier Part Number 1: C32949
C3 C4 C21 = CAPACITOR_CL10A225KO8NNNC: Capacitor - 2.2uF - 16V - 0603 - X5R; Manufacturer 1: Samsung; Manufacturer Part Number 1: CL10A225KO8NNNC; Supplier 1: LCSC; Supplier Part Number 1: C23630
C7-C20 C22-C25 = CAPACITOR_CL05B104KB54PNC: Capacitor - 100nF - 50V - 0402 - X7R; Manufacturer 1: Samsung; Manufacturer Part Number 1: CL05B104KB54PNC; Supplier 1: LCSC; Supplier Part Number 1: C307331
R19 = RESISTOR_0402WGF330JTCE: as R18 on sheet MCU_IO; Manufacturer Part Number 1: 0402WGF330JTCE; Supplier 1: LCSC; Supplier Part Number 1: C25105
R20 = RESISTOR_0402WGF2003TCE: as R2 on sheet MCU_IO; Manufacturer Part Number 1: 0402WGF2003TCE; Supplier 1: LCSC; Supplier Part Number 1: C25764
R21 = RESISTOR_0402WGF1502TCE: as R1 on sheet MCU_IO; Manufacturer Part Number 1: 0402WGF1502TCE; Supplier 1: LCSC; Supplier Part Number 1: C25756
SW2 SW3 = SWITCH_Tactile_TS-1088-AR02016: Push button; Manufacturer 1: XUNPU; Supplier 1: LCSC; Supplier Part Number 1: C720477; Manufacturer Part Number 1: TS-1088-AR02016
TP1 = TESTPOINT_1mm: TestPoint 1mm
U1 = MCU_STM32H523ZETx: as U1 on sheet MCU_IO; Supplier 1: Mouser; Supplier Part Number 1: 511-STM32H523ZET6
X1 = CRYSTAL_NX3225GD-8MHZ-STD-CRA-3: 8Mhz crystal 3225-2P; Manufacturer 1: NDK; Manufacturer Part Number 1: NX3225GD-8MHZ-STD-CRA-3; Supplier 1: LCSC; Supplier Part Number 1: C889706
X2 = CRYSTAL_FC-135 32.7680KA-AG3: 32.768kHz crystal 3215-2P; Manufacturer 1: Seiko Epson; Manufacturer Part Number 1: FC-135 32.7680KA-AG3; Supplier 1: LCSC; Supplier Part Number 1: C7275970

## Sheet SDMMC.SchDoc: Skipper SD Card Slot
size 297 x 210 mm; Author: Jack Herron; SheetNumber: 5; SheetTotal: 11
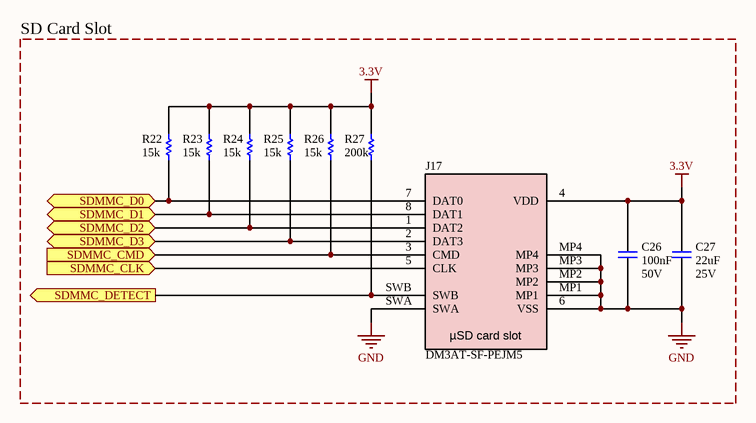
[diagram p3: SDMMC.SchDoc]

### Parts
C26  value 100nF  Voltage: 50V  [CAPACITOR-0402]  (hidden comment: CL05B104KB54PNC)
C27  value 22uF  Voltage: 25V  [CAPACITOR-1206]  (hidden comment: CL31A226KAHNNNE)
J17  DM3AT-SF-PEJM5  [CONNECTOR_MICRO-SD_DM3AT-SF-PEJM5]
R22  value 15k  [RESISTOR-0402]  (hidden comment: 0402WGF1502TCE)
R23  value 15k  [RESISTOR-0402]  (hidden comment: 0402WGF1502TCE)
R24  value 15k  [RESISTOR-0402]  (hidden comment: 0402WGF1502TCE)
R25  value 15k  [RESISTOR-0402]  (hidden comment: 0402WGF1502TCE)
R26  value 15k  [RESISTOR-0402]  (hidden comment: 0402WGF1502TCE)
R27  value 200k  [RESISTOR-0402]  (hidden comment: 0402WGF2003TCE)

### Blocks framed on the sheet
SD Card Slot: C26 C27 J17 R22-R27

### Ports
SDMMC_CLK (in, see Top_Sheet[2C], MCU_IO[2D]), SDMMC_CMD (in, see Top_Sheet[2C], MCU_IO[1C]), SDMMC_D0 (bidir, see Top_Sheet[2C], MCU_IO[1C]), SDMMC_D1 (bidir, see Top_Sheet[2C], MCU_IO[1C]), SDMMC_D2 (bidir, see Top_Sheet[2C], MCU_IO[1C]), SDMMC_D3 (bidir, see Top_Sheet[2C], MCU_IO[1C]), SDMMC_DETECT (out, see Top_Sheet[2C], MCU_IO[3B])

### Nets
3.3V: C26.2 C27.2 J17.4(VDD) R22.2 R23.2 R24.2 R25.2 R26.2 R27.2
GND: C26.1 C27.1 J17.6(VSS) J17.MP1 J17.MP2 J17.MP3 J17.MP4 J17.SWA
SDMMC_CLK: J17.5(CLK) ; port SDMMC_CLK
SDMMC_CMD: J17.3(CMD) R26.1 ; port SDMMC_CMD
SDMMC_D0: J17.7(DAT0) R22.1 ; port SDMMC_D0
SDMMC_D1: J17.8(DAT1) R23.1 ; port SDMMC_D1
SDMMC_D2: J17.1(DAT2) R24.1 ; port SDMMC_D2
SDMMC_D3: J17.2(DAT3) R25.1 ; port SDMMC_D3
SDMMC_DETECT: J17.SWB R27.1 ; port SDMMC_DETECT

### Notes on the sheet
- Title:
- File:
- Date:
- Project:
- Author:
- (in symbol CONNECTOR_MICRO-SD_DM3AT-SF-PEJM5) µSD card slot

### Library data of the parts
C26 = CAPACITOR_CL05B104KB54PNC: as C7 on sheet MCU_Core; Manufacturer Part Number 1: CL05B104KB54PNC; Supplier 1: LCSC; Supplier Part Number 1: C307331
C27 = CAPACITOR_CL31A226KAHNNNE: Capacitor - 22uF - 25V - 1206; Manufacturer 1: Samsung; Manufacturer Part Number 1: CL31A226KAHNNNE; Supplier 1: LCSC; Supplier Part Number 1: C12891
J17 = CONNECTOR_MICRO-SD_DM3AT-SF-PEJM5: Micro SD Card scoket; Manufacturer 1: Hirose; Manufacturer Part Number 1: DM3AT-SF-PEJM5; Supplier 1: LCSC; Supplier Part Number 1: C114218
R22-R26 = RESISTOR_0402WGF1502TCE: as R1 on sheet MCU_IO; Manufacturer Part Number 1: 0402WGF1502TCE; Supplier 1: LCSC; Supplier Part Number 1: C25756
R27 = RESISTOR_0402WGF2003TCE: as R2 on sheet MCU_IO; Manufacturer Part Number 1: 0402WGF2003TCE; Supplier 1: LCSC; Supplier Part Number 1: C25764

## Sheet USBC_DRP.SchDoc: Skipper USBC DRP
size 297 x 210 mm; Author: Jack Herron; SheetNumber: 6; SheetTotal: 11
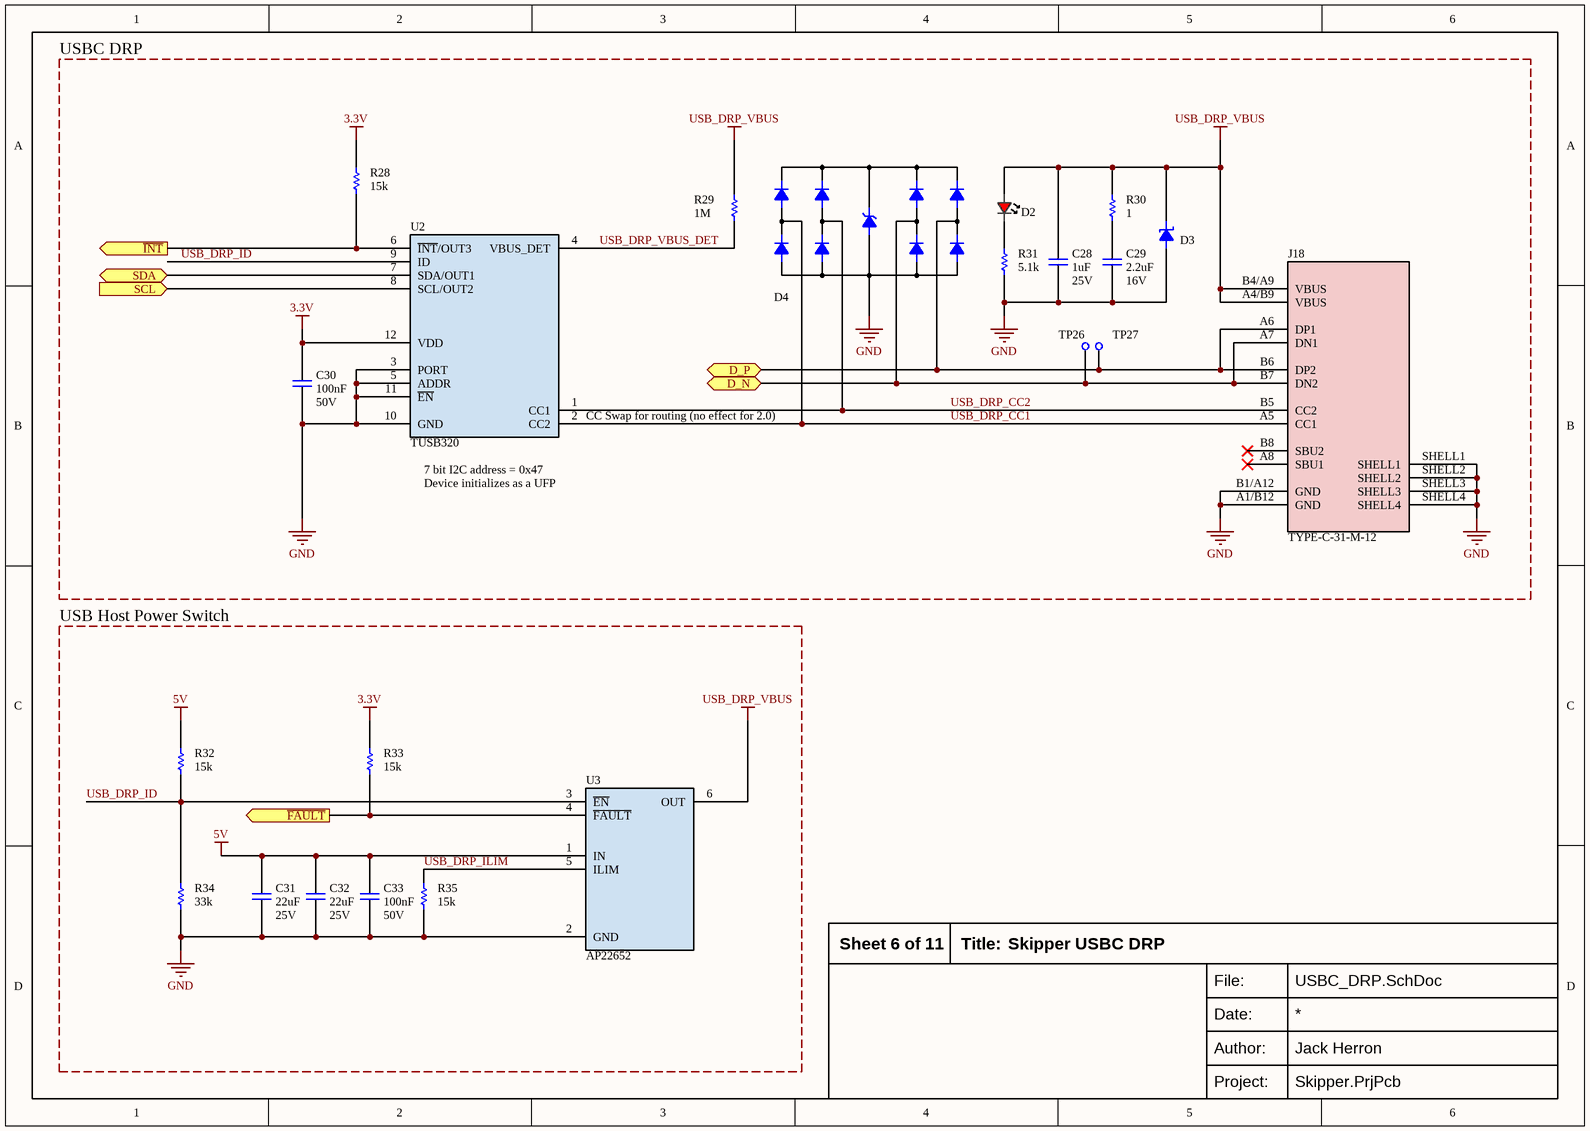
[diagram p4: USBC_DRP.SchDoc]

### Parts
C28  value 1uF  Voltage: 25V  [CAPACITOR-0402]  (hidden comment: CL05A105KA5NQNC)
C29  value 2.2uF  Voltage: 16V  [CAPACITOR-0603]  (hidden comment: CL10A225KO8NNNC)
C30  value 100nF  Voltage: 50V  [CAPACITOR-0402]  (hidden comment: CL05B104KB54PNC)
C31  value 22uF  Voltage: 25V  [CAPACITOR-1206]  (hidden comment: CL31A226KAHNNNE)
C32  value 22uF  Voltage: 25V  [CAPACITOR-1206]  (hidden comment: CL31A226KAHNNNE)
C33  value 100nF  Voltage: 50V  [CAPACITOR-0402]  (hidden comment: CL05B104KB54PNC)
D2  KT-0603R  [LED-0603]  (value not drawn)
D3  SMF5.0A  [DIODE-SOD-123FL]  (value not drawn)
D4  TPD4E1U06DBVR-TP  [SOT23-6]  (value not drawn)
J18  TYPE-C-31-M-12  [CONNECTOR_USBC_TYPE-C-31-M-12]
R28  value 15k  [RESISTOR-0402]  (hidden comment: 0402WGF1502TCE)
R29  value 1M  [RESISTOR-0402]  (hidden comment: 0402WGF1004TCE)
R30  value 1  [RESISTOR-0603]  (hidden comment: 0603WAF100KT5E)
R31  value 5.1k  [RESISTOR-0402]  (hidden comment: 0402WGF5101TCE)
R32  value 15k  [RESISTOR-0402]  (hidden comment: 0402WGF1502TCE)
R33  value 15k  [RESISTOR-0402]  (hidden comment: 0402WGF1502TCE)
R34  value 33k  [RESISTOR-0402]  (hidden comment: 0402WGF3302TCE)
R35  value 15k  [RESISTOR-0402]  (hidden comment: 0402WGF1502TCE)
TP26  RH-5019  [TESTPOINT_RH-5019]  (value not drawn)
TP27  RH-5019  [TESTPOINT_RH-5019]  (value not drawn)
U2  TUSB320  [RWB0012A]
U3  AP22652  [SOT23-6]

### Blocks framed on the sheet
USBC DRP: C28-C30 D2-D4 J18 R28-R31 TP26 TP27 U2
USB Host Power Switch: C31-C33 R32-R35 U3

### Ports
D_N (bidir, see Top_Sheet[1C]), D_P (bidir, see Top_Sheet[1C]), SCL (in, see Top_Sheet[1C]), SDA (bidir, see Top_Sheet[1C]), ~{FAULT} (out, see Top_Sheet[2C]), ~{INT} (out, see Top_Sheet[1C])

### Nets
3.3V: C30.2 R28.2 R33.2 U2.12(VDD)
5V: C31.2 C32.2 C33.2 R32.2 U3.1(IN)
GND: C28.1 C29.1 C30.1 C31.1 C32.1 C33.1 D3.A D4.2 J18.A1/B12(GND) J18.B1/A12(GND) J18.SHELL1 J18.SHELL2 J18.SHELL3 J18.SHELL4 R31.1 R34.1 R35.1 U2.3(PORT) U2.5(ADDR) U2.10(GND) U2.11(~{EN}) U3.2(GND)
USB_DRP_VBUS: C28.2 D2.A D3.K J18.A4/B9(VBUS) J18.B4/A9(VBUS) R29.2 R30.2 U3.6(OUT)
I2C2_SCL: U2.8(SCL/OUT2) ; port SCL
I2C2_SDA: U2.7(SDA/OUT1) ; port SDA
USB_D_N: D4.4 J18.A7(DN1) J18.B7(DN2) TP26.1 ; port D_N
USB_D_P: D4.6 J18.A6(DP1) J18.B6(DP2) TP27.1 ; port D_P
USB_DRP_CC1: D4.1 J18.A5(CC1) U2.2(CC2)  [project net USB_DRP_CC1_6]
USB_DRP_CC2: D4.3 J18.B5(CC2) U2.1(CC1)  [project net USB_DRP_CC2_6]
USB_DRP_~{FAULT}: R33.1 U3.4(~{FAULT}) ; port ~{FAULT}
USB_DRP_~{INT}: R28.1 U2.6(~{INT}/OUT3) ; port ~{INT}
USB_DRP_ID: R32.1 R34.2 U2.9(ID) U3.3(~{EN})  [project net USB_DRP_ID_6]
USB_DRP_ILIM: R35.2 U3.5(ILIM)  [project net USB_DRP_ILIM_6]
USB_DRP_VBUS_DET: R29.1 U2.4(VBUS_DET)  [project net USB_DRP_VBUS_DET_6]
NetC29_2: C29.2 R30.1
NetD2_K: D2.K R31.2

Not connected (* = marked no-connect by the designer): J18 A8(SBU1)* B8(SBU2)*

### Notes on the sheet
- (near U2) 7 bit I2C address = 0x47
- (near U2) CC Swap for routing (no effect for 2.0)
- Device initializes as a UFP
- Title:
- File:
- Date:
- Project:
- Author:

### Library data of the parts
C28 = CAPACITOR_CL05A105KA5NQNC: Capacitor - 1uF - 25V - 0402 - X5R; Manufacturer 1: Samsung; Manufacturer Part Number 1: CL05A105KA5NQNC; Supplier 1: LCSC; Supplier Part Number 1: C52923
C29 = CAPACITOR_CL10A225KO8NNNC: as C3 on sheet MCU_Core; Manufacturer Part Number 1: CL10A225KO8NNNC; Supplier 1: LCSC; Supplier Part Number 1: C23630
C30 C33 = CAPACITOR_CL05B104KB54PNC: as C7 on sheet MCU_Core; Manufacturer Part Number 1: CL05B104KB54PNC; Supplier 1: LCSC; Supplier Part Number 1: C307331
C31 C32 = CAPACITOR_CL31A226KAHNNNE: as C27 on sheet SDMMC; Manufacturer Part Number 1: CL31A226KAHNNNE; Supplier 1: LCSC; Supplier Part Number 1: C12891
D2 = LED_KT-0603R: as D1 on sheet MCU_IO; Manufacturer Part Number 1: KT-0603R; Supplier 1: LCSC; Supplier Part Number 1: C2286
D3 = DIODE_TVS_UNIDIRECTIONAL_5-7-9.2V_SMF5.0A: TVS Diode 5V standoff, 7V breakdown, 9.2V clamp; Manufacturer 1: Littelfuse; Manufacturer Part Number 1: SMF5.0A; Supplier 1: LCSC; Supplier Part Number 1: C151296
D4 = ESD-ARRAY_4-Channel_TPD4E1U06DBVR-TP: Diode - TVS - USB ESD Protection - SOT23-6; Manufacturer 1: Tech Public; Manufacturer Part Number 1: TPD4E1U06DBVR-TP; Supplier 1: LCSC; Supplier Part Number 1: C2841427
J18 = CONNECTOR_USBC_TYPE-C-31-M-12: USB Recepticle - Type-C; Manufacturer 1: Korean Hroparts Elec; Manufacturer Part Number 1: TYPE-C-31-M-12; Supplier 1: LCSC; Supplier Part Number 1: C165948
R28 R32 R33 R35 = RESISTOR_0402WGF1502TCE: as R1 on sheet MCU_IO; Manufacturer Part Number 1: 0402WGF1502TCE; Supplier 1: LCSC; Supplier Part Number 1: C25756
R29 = RESISTOR_0402WGF1004TCE: Resistor - 1M - 0402; Manufacturer 1: UNI-ROYAL; Voltage: 50V; Wattage: 62.5mW; Manufacturer Part Number 1: 0402WGF1004TCE; Supplier 1: LCSC; Supplier Part Number 1: C26083
R30 = RESISTOR_0603WAF100KT5E: Resistor - 1 - 0603; Manufacturer 1: UNI-ROYAL; Voltage: 75V; Wattage: 100mW; Manufacturer Part Number 1: 0603WAF100KT5E; Supplier 1: LCSC; Supplier Part Number 1: C22936
R31 = RESISTOR_0402WGF5101TCE: as R9 on sheet MCU_IO; Manufacturer Part Number 1: 0402WGF5101TCE; Supplier 1: LCSC; Supplier Part Number 1: C25905
R34 = RESISTOR_0402WGF3302TCE: Resistor - 33k - 0402; Manufacturer 1: UNI-ROYAL; Voltage: 50V; Wattage: 62.5mW; Supplier 1: LCSC; Supplier Part Number 1: C25779; Manufacturer Part Number 1: 0402WGF3302TCE
TP26 TP27 = TESTPOINT_RH-5019: SMD testpoint; Manufacturer 1: ronghe; Manufacturer Part Number 1: RH-5019; Supplier 1: LCSC; Supplier Part Number 1: C5199800
U2 = INTERFACE_USBC-Port-Controller_TUSB320: USBC power port controller; Manufacturer 1: Texas Instruments; Manufacturer Part Number 1: TUSB320LAIRWBR; Supplier 1: LCSC; Supplier Part Number 1: C132554
U3 = POWER-SWITCH_ AP22652: Active low USB power switch; Manufacturer 1: Diodes Inc.; Manufacturer Part Number 1: AP22652W6-7; Supplier 1: LCSC; Supplier Part Number 1: C2158038

## Sheet USBC_UFP.SchDoc: Skipper USBC UFP
size 297 x 210 mm; Author: Jack Herron; SheetNumber: 7; SheetTotal: 11
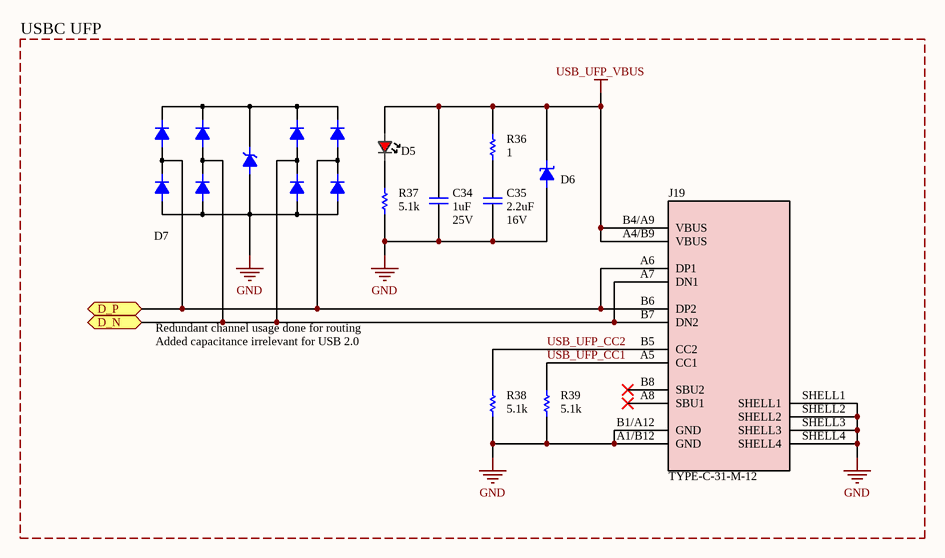
[diagram p5: USBC_UFP.SchDoc]

### Parts
C34  value 1uF  Voltage: 25V  [CAPACITOR-0402]  (hidden comment: CL05A105KA5NQNC)
C35  value 2.2uF  Voltage: 16V  [CAPACITOR-0603]  (hidden comment: CL10A225KO8NNNC)
D5  KT-0603R  [LED-0603]  (value not drawn)
D6  SMF5.0A  [DIODE-SOD-123FL]  (value not drawn)
D7  TPD4E1U06DBVR-TP  [SOT23-6]  (value not drawn)
J19  TYPE-C-31-M-12  [CONNECTOR_USBC_TYPE-C-31-M-12]
R36  value 1  [RESISTOR-0603]  (hidden comment: 0603WAF100KT5E)
R37  value 5.1k  [RESISTOR-0402]  (hidden comment: 0402WGF5101TCE)
R38  value 5.1k  [RESISTOR-0402]  (hidden comment: 0402WGF5101TCE)
R39  value 5.1k  [RESISTOR-0402]  (hidden comment: 0402WGF5101TCE)

### Ports
D_N (bidir, see Top_Sheet[3D]), D_P (bidir, see Top_Sheet[3D])

### Nets
GND: C34.1 C35.1 D6.A D7.2 J19.A1/B12(GND) J19.B1/A12(GND) J19.SHELL1 J19.SHELL2 J19.SHELL3 J19.SHELL4 R37.1 R38.1 R39.1
USB_UFP_VBUS: C34.2 D5.A D6.K J19.A4/B9(VBUS) J19.B4/A9(VBUS) R36.2
DAP_D_N: D7.3 D7.4 J19.A7(DN1) J19.B7(DN2) ; port D_N
DAP_D_P: D7.1 D7.6 J19.A6(DP1) J19.B6(DP2) ; port D_P
USB_UFP_CC1: J19.A5(CC1) R39.2  [project net USB_UFP_CC1_7]
USB_UFP_CC2: J19.B5(CC2) R38.2  [project net USB_UFP_CC2_7]
NetC35_2: C35.2 R36.1
NetD5_K: D5.K R37.2

Not connected (* = marked no-connect by the designer): J19 A8(SBU1)* B8(SBU2)*

### Notes on the sheet
- USBC UFP
- Redundant channel usage done for routing
- Added capacitance irrelevant for USB 2.0
- Title:
- File:
- Date:
- Project:
- Author:

### Library data of the parts
C34 = CAPACITOR_CL05A105KA5NQNC: as C28 on sheet USBC_DRP; Manufacturer Part Number 1: CL05A105KA5NQNC; Supplier 1: LCSC; Supplier Part Number 1: C52923
C35 = CAPACITOR_CL10A225KO8NNNC: as C3 on sheet MCU_Core; Manufacturer Part Number 1: CL10A225KO8NNNC; Supplier 1: LCSC; Supplier Part Number 1: C23630
D5 = LED_KT-0603R: as D1 on sheet MCU_IO; Manufacturer Part Number 1: KT-0603R; Supplier 1: LCSC; Supplier Part Number 1: C2286
D6 = DIODE_TVS_UNIDIRECTIONAL_5-7-9.2V_SMF5.0A: as D3 on sheet USBC_DRP; Manufacturer Part Number 1: SMF5.0A; Supplier 1: LCSC; Supplier Part Number 1: C151296
D7 = ESD-ARRAY_4-Channel_TPD4E1U06DBVR-TP: as D4 on sheet USBC_DRP; Manufacturer Part Number 1: TPD4E1U06DBVR-TP; Supplier 1: LCSC; Supplier Part Number 1: C2841427
J19 = CONNECTOR_USBC_TYPE-C-31-M-12: as J18 on sheet USBC_DRP; Manufacturer Part Number 1: TYPE-C-31-M-12; Supplier 1: LCSC; Supplier Part Number 1: C165948
R36 = RESISTOR_0603WAF100KT5E: as R30 on sheet USBC_DRP; Manufacturer Part Number 1: 0603WAF100KT5E; Supplier 1: LCSC; Supplier Part Number 1: C22936
R37-R39 = RESISTOR_0402WGF5101TCE: as R9 on sheet MCU_IO; Manufacturer Part Number 1: 0402WGF5101TCE; Supplier 1: LCSC; Supplier Part Number 1: C25905

## Sheet CAN.SchDoc: Skipper CAN Transceiver
size 297 x 210 mm; Author: Jack Herron; SheetNumber: 8; SheetTotal: 11
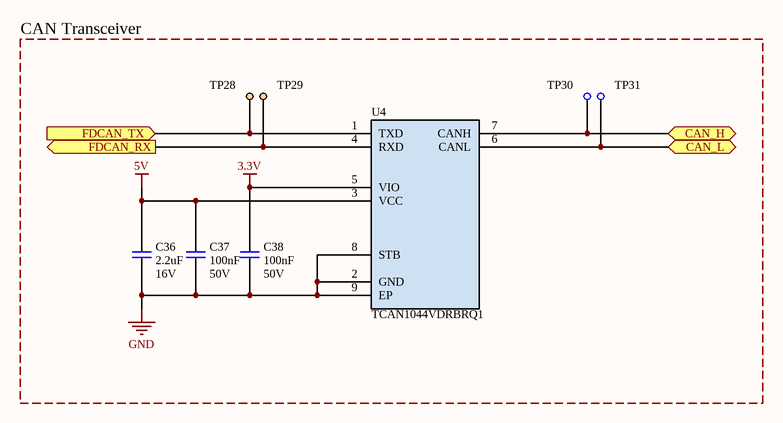
[diagram p6: CAN.SchDoc]

### Parts
C36  value 2.2uF  Voltage: 16V  [CAPACITOR-0603]  (hidden comment: CL10A225KO8NNNC)
C37  value 100nF  Voltage: 50V  [CAPACITOR-0402]  (hidden comment: CL05B104KB54PNC)
C38  value 100nF  Voltage: 50V  [CAPACITOR-0402]  (hidden comment: CL05B104KB54PNC)
TP28  Test Point 2mm  [TESTPOINT_2mm]  (value not drawn)  (no BOM)
TP29  Test Point 2mm  [TESTPOINT_2mm]  (value not drawn)  (no BOM)
TP30  RH-5019  [TESTPOINT_RH-5019]  (value not drawn)
TP31  RH-5019  [TESTPOINT_RH-5019]  (value not drawn)
U4  TCAN1044VDRBRQ1  [SON-8-3x3]

### Blocks framed on the sheet
CAN Transceiver: C36-C38 TP28-TP31 U4

### Ports
CAN_H (bidir, see Top_Sheet[2D], Bus_Access[3C]), CAN_L (bidir, see Top_Sheet[2D], Bus_Access[3C]), FDCAN_RX (out, see Top_Sheet[2C], MCU_IO[1C]), FDCAN_TX (in, see Top_Sheet[2C], MCU_IO[1C])

### Nets
3.3V: C38.2 U4.5(VIO)
5V: C36.2 C37.2 U4.3(VCC)
GND: C36.1 C37.1 C38.1 U4.2(GND) U4.8(STB) U4.9(EP)
CAN_H: TP30.1 U4.7(CANH) ; port CAN_H
CAN_L: TP31.1 U4.6(CANL) ; port CAN_L
FDCAN_RX: TP29.1 U4.4(RXD) ; port FDCAN_RX
FDCAN_TX: TP28.1 U4.1(TXD) ; port FDCAN_TX

### Notes on the sheet
- Title:
- File:
- Date:
- Project:
- Author:

### Library data of the parts
C36 = CAPACITOR_CL10A225KO8NNNC: as C3 on sheet MCU_Core; Manufacturer Part Number 1: CL10A225KO8NNNC; Supplier 1: LCSC; Supplier Part Number 1: C23630
C37 C38 = CAPACITOR_CL05B104KB54PNC: as C7 on sheet MCU_Core; Manufacturer Part Number 1: CL05B104KB54PNC; Supplier 1: LCSC; Supplier Part Number 1: C307331
TP28 TP29 = TESTPOINT_2mm: TestPoint 2mm
TP30 TP31 = TESTPOINT_RH-5019: SMD testpoint; Manufacturer 1: ronghe; Manufacturer Part Number 1: RH-5019; Supplier 1: LCSC; Supplier Part Number 1: C5199800
U4 = TRANSCEIVER_TCAN1044V: CAN Tranceiver; Manufacturer 1: Texas Instruments; Manufacturer Part Number 1: TCAN1044VDRBRQ1; Supplier 1: LCSC; Supplier Part Number 1: C5215851

## Sheet DAP.SchDoc: Skipper DAP
size 297 x 210 mm; Author: Jack Herron; SheetNumber: 9; SheetTotal: 11
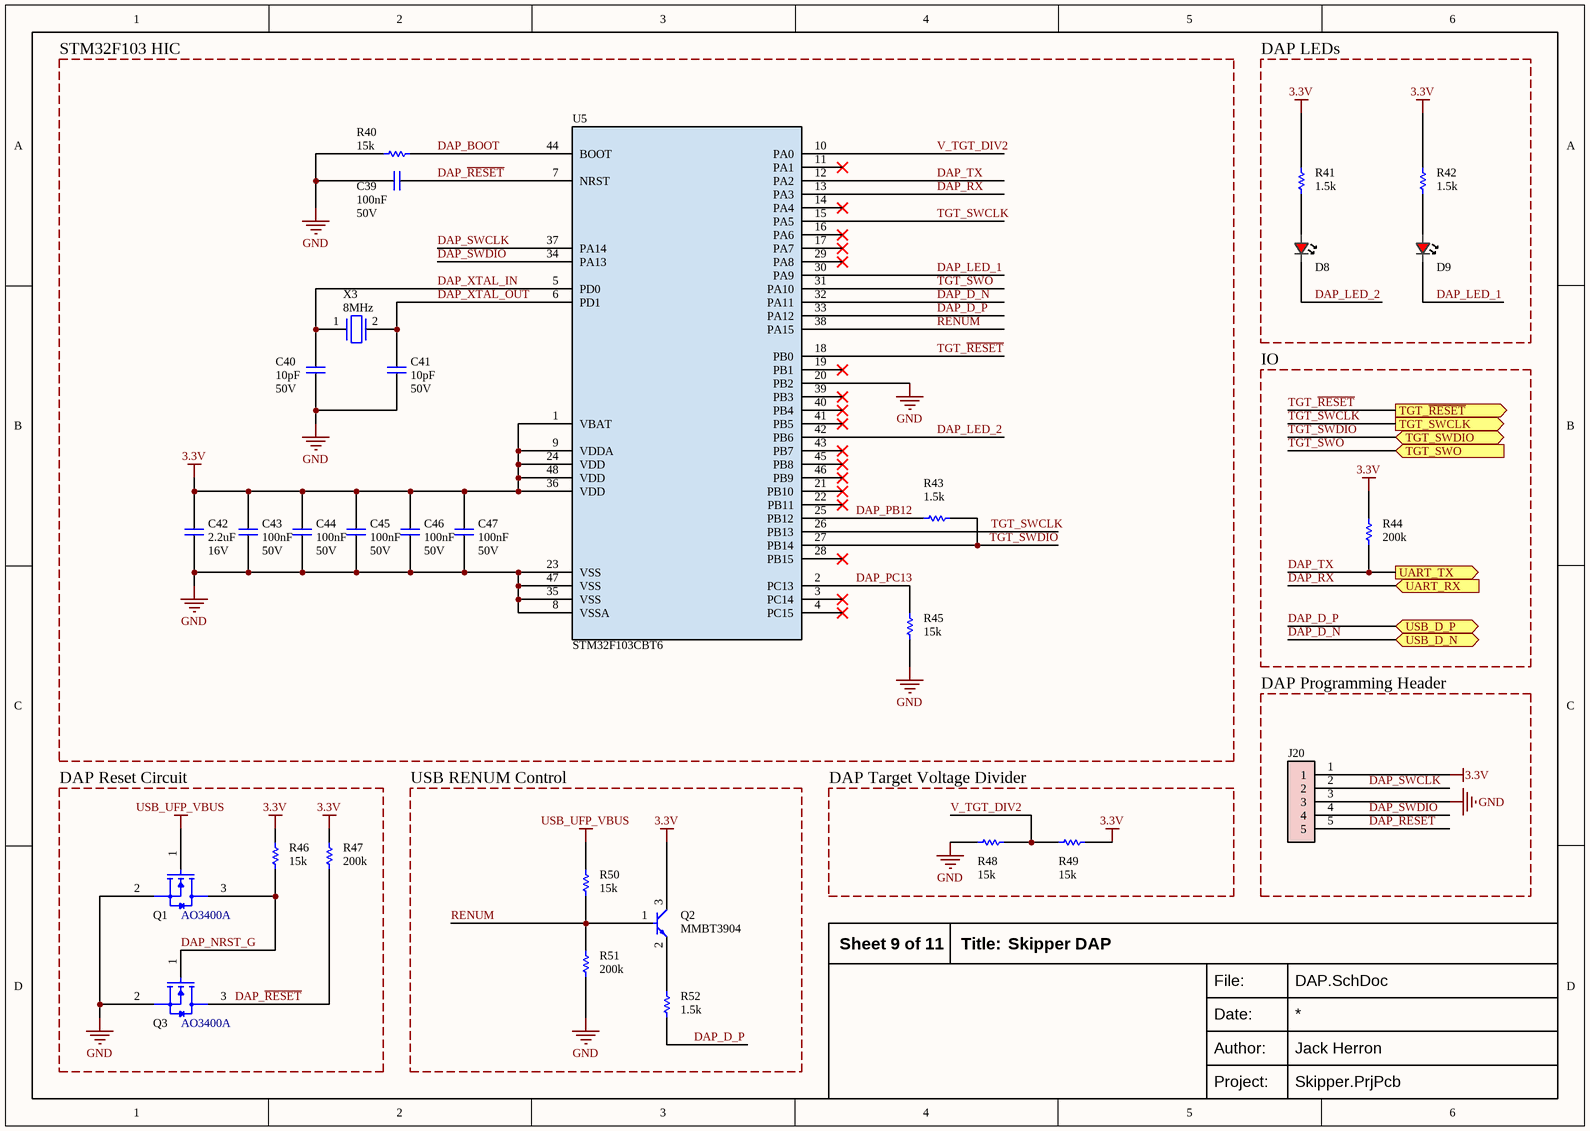
[diagram p7: DAP.SchDoc]

### Parts
C39  value 100nF  Voltage: 50V  [CAPACITOR-0402]  (hidden comment: CL05B104KB54PNC)
C40  value 10pF  Voltage: 50V  [CAPACITOR-0402]  (hidden comment: CL05C100JB5NNNC)
C41  value 10pF  Voltage: 50V  [CAPACITOR-0402]  (hidden comment: CL05C100JB5NNNC)
C42  value 2.2uF  Voltage: 16V  [CAPACITOR-0603]  (hidden comment: CL10A225KO8NNNC)
C43  value 100nF  Voltage: 50V  [CAPACITOR-0402]  (hidden comment: CL05B104KB54PNC)
C44  value 100nF  Voltage: 50V  [CAPACITOR-0402]  (hidden comment: CL05B104KB54PNC)
C45  value 100nF  Voltage: 50V  [CAPACITOR-0402]  (hidden comment: CL05B104KB54PNC)
C46  value 100nF  Voltage: 50V  [CAPACITOR-0402]  (hidden comment: CL05B104KB54PNC)
C47  value 100nF  Voltage: 50V  [CAPACITOR-0402]  (hidden comment: CL05B104KB54PNC)
D8  KT-0603R  [LED-0603]  (value not drawn)
D9  KT-0603R  [LED-0603]  (value not drawn)
J20  Connector_2.54mm-1x5-unpopulated  [CONNECTOR_Header_2.54mm_1x5]  (value not drawn)  (no BOM)
Q1  AO3400A  [SOT23-3]
Q2  MMBT3904  [SOT23-3]
Q3  AO3400A  [SOT23-3]
R40  value 15k  [RESISTOR-0402]  (hidden comment: 0402WGF1502TCE)
R41  value 1.5k  [RESISTOR-0402]  (hidden comment: 0402WGF1501TCE)
R42  value 1.5k  [RESISTOR-0402]  (hidden comment: 0402WGF1501TCE)
R43  value 1.5k  [RESISTOR-0402]  (hidden comment: 0402WGF1501TCE)
R44  value 200k  [RESISTOR-0402]  (hidden comment: 0402WGF2003TCE)
R45  value 15k  [RESISTOR-0402]  (hidden comment: 0402WGF1502TCE)
R46  value 15k  [RESISTOR-0402]  (hidden comment: 0402WGF1502TCE)
R47  value 200k  [RESISTOR-0402]  (hidden comment: 0402WGF2003TCE)
R48  value 15k  [RESISTOR-0402]  (hidden comment: 0402WGF1502TCE)
R49  value 15k  [RESISTOR-0402]  (hidden comment: 0402WGF1502TCE)
R50  value 15k  [RESISTOR-0402]  (hidden comment: 0402WGF1502TCE)
R51  value 200k  [RESISTOR-0402]  (hidden comment: 0402WGF2003TCE)
R52  value 1.5k  [RESISTOR-0402]  (hidden comment: 0402WGF1501TCE)
U5  STM32F103CBT6  [LQFP-48-7x7]
X3  value 8MHz  [CRYSTAL_3225-2P]  (hidden comment: NX3225GD-8MHZ-STD-CRA-3)

### Blocks framed on the sheet
STM32F103 HIC: C39-C47 R40 R43 R45 U5 X3
DAP LEDs: D8 D9 R41 R42
IO: R44
DAP Programming Header: J20
DAP Reset Circuit: Q1 Q3 R46 R47
USB RENUM Control: Q2 R50-R52
DAP Target Voltage Divider: R48 R49

### Ports
TGT_SWCLK (out, see Top_Sheet[3C]), TGT_SWDIO (bidir, see Top_Sheet[3C]), TGT_SWO (in, see Top_Sheet[3C]), TGT_~{RESET} (out, see Top_Sheet[3C]), UART_RX (in, see Top_Sheet[3C]), UART_TX (out, see Top_Sheet[3C]), USB_D_N (bidir, see Top_Sheet[3D]), USB_D_P (bidir, see Top_Sheet[3D])

### Nets
3.3V: C42.2 C43.2 C44.2 C45.2 C46.2 C47.2 J20.1 Q2.3(C) R41.2 R42.2 R44.2 R46.2 R47.2 R49.1 U5.1(VBAT) U5.9(VDDA) U5.24(VDD) U5.36(VDD) U5.48(VDD)
GND: C39.2 C40.1 C41.1 C42.1 C43.1 C44.1 C45.1 C46.1 C47.1 J20.3 Q1.2(S) Q3.2(S) R40.1 R45.1 R48.2 R51.1 U5.8(VSSA) U5.20(PB2) U5.23(VSS) U5.35(VSS) U5.47(VSS)
USB_UFP_VBUS: Q1.1(G) R50.2
DAP_BOOT: R40.2 U5.44(BOOT)  [project net DAP_BOOT_9]
DAP_D_N: U5.32(PA11) ; port USB_D_N
DAP_D_P: R52.1 U5.33(PA12) ; port USB_D_P
DAP_LED_1: D9.K U5.30(PA9)  [project net DAP_LED_1_9]
DAP_LED_2: D8.K U5.42(PB6)  [project net DAP_LED_2_9]
DAP_NRST_G: Q1.3(D) Q3.1(G) R46.1  [project net DAP_NRST_G_9]
DAP_PB12: R43.2 U5.25(PB12)  [project net DAP_PB12_9]
DAP_PC13: R45.2 U5.2(PC13)  [project net DAP_PC13_9]
DAP_~{RESET}: C39.1 J20.5 Q3.3(D) R47.1 U5.7(NRST)  [project net DAP_~{RESET}_9]
DAP_RX: U5.13(PA3) ; port UART_RX
DAP_SWCLK: J20.2 U5.37(PA14)  [project net DAP_SWCLK_9]
DAP_SWDIO: J20.4 U5.34(PA13)  [project net DAP_SWDIO_9]
DAP_TX: R44.1 U5.12(PA2) ; port UART_TX
DAP_XTAL_IN: C40.2 U5.5(PD0) X3.1  [project net DAP_XTAL_IN_9]
DAP_XTAL_OUT: C41.2 U5.6(PD1) X3.2  [project net DAP_XTAL_OUT_9]
RENUM: Q2.1(B) R50.1 R51.2 U5.38(PA15)  [project net RENUM_9]
TGT_~{RESET}: U5.18(PB0) ; port TGT_~{RESET}  [project net NRST]
TGT_SWCLK: U5.15(PA5) U5.26(PB13) ; port TGT_SWCLK  [project net SWCLK]
TGT_SWDIO: R43.1 U5.27(PB14) ; port TGT_SWDIO  [project net SWDIO]
TGT_SWO: U5.31(PA10) ; port TGT_SWO  [project net SWO]
V_TGT_DIV2: R48.1 R49.2 U5.10(PA0)  [project net V_TGT_DIV2_9]
NetD8_A: D8.A R41.1
NetD9_A: D9.A R42.1
NetQ2_2: Q2.2(E) R52.2

Not connected (* = marked no-connect by the designer): U5 3(PC14)* 4(PC15)* 11(PA1)* 14(PA4)* 16(PA6)* 17(PA7)* 19(PB1)* 21(PB10)* 22(PB11)* 28(PB15)* 29(PA8)* 39(PB3)* 40(PB4)* 41(PB5)* 43(PB7)* 45(PB8)* 46(PB9)*

### Notes on the sheet
- Title:
- File:
- Date:
- Project:
- Author:

### Library data of the parts
C39 C43-C47 = CAPACITOR_CL05B104KB54PNC: as C7 on sheet MCU_Core; Manufacturer Part Number 1: CL05B104KB54PNC; Supplier 1: LCSC; Supplier Part Number 1: C307331
C40 C41 = CAPACITOR_CL05C100JB5NNNC: as C1 on sheet MCU_Core; Manufacturer Part Number 1: CL05C100JB5NNNC; Supplier 1: LCSC; Supplier Part Number 1: C32949
C42 = CAPACITOR_CL10A225KO8NNNC: as C3 on sheet MCU_Core; Manufacturer Part Number 1: CL10A225KO8NNNC; Supplier 1: LCSC; Supplier Part Number 1: C23630
D8 D9 = LED_KT-0603R: as D1 on sheet MCU_IO; Manufacturer Part Number 1: KT-0603R; Supplier 1: LCSC; Supplier Part Number 1: C2286
J20 = CONNECTOR_2.54mm-1x5-unpopulated: Connector - 2.54mm - 1x5 - unpopulated
Q1 Q3 = AO3400A: N Channel Mosfet - 26.5mΩ - SOT23-3; Manufacturer 1: AOS; Manufacturer Part Number 1: AO3400A; Supplier 2: DigiKey; Supplier Part Number 2: 785-1000-1-ND; Supplier 1: LCSC; Supplier Part Number 1: C20917
Q2 = TRANSISTOR_NPN-BJT_MMBT3904: NPN Transistor; Manufacturer 1: Jiangsu Changjing Electronics Technology Co., Ltd.; Manufacturer Part Number 1: MMBT3904; Supplier 1: LCSC; Supplier Part Number 1: C20526
R40 R45 R46 R48-R50 = RESISTOR_0402WGF1502TCE: as R1 on sheet MCU_IO; Manufacturer Part Number 1: 0402WGF1502TCE; Supplier 1: LCSC; Supplier Part Number 1: C25756
R41-R43 R52 = RESISTOR_0402WGF1501TCE: as R11 on sheet MCU_IO; Manufacturer Part Number 1: 0402WGF1501TCE; Supplier 1: LCSC; Supplier Part Number 1: C25867
R44 R47 R51 = RESISTOR_0402WGF2003TCE: as R2 on sheet MCU_IO; Manufacturer Part Number 1: 0402WGF2003TCE; Supplier 1: LCSC; Supplier Part Number 1: C25764
U5 = MCU_STM32F103CBT6: Arm Cortex-M3 MCU - 128KB Flash - 20KB SRAM - 72 MHz - LQFP48; Manufacturer 1: STMicroelectronics; Manufacturer Part Number 1: STM32F103CBT6; Supplier 1: LCSC; Supplier Part Number 1: C8304
X3 = CRYSTAL_NX3225GD-8MHZ-STD-CRA-3: as X1 on sheet MCU_Core; Manufacturer Part Number 1: NX3225GD-8MHZ-STD-CRA-3; Supplier 1: LCSC; Supplier Part Number 1: C889706